# Altium project EFI_Main_Board-V1.11.PrjPcb (part 1 of 4)
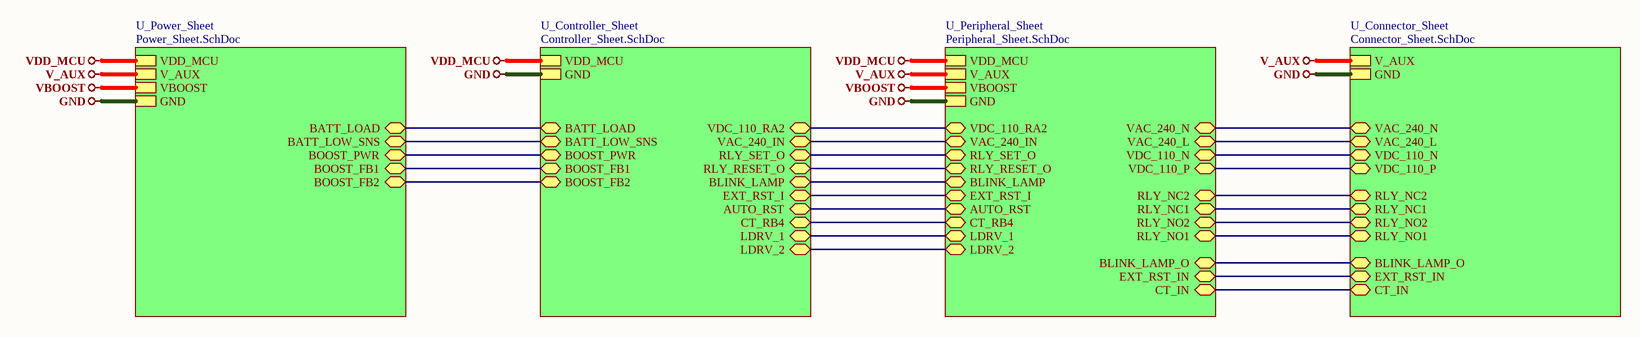
[diagram p0: Top-Sheet.SchDoc]
5 sheets, 101 parts. Net scope: hierarchical (ports join the sheet entries above them; power ports are global).
Board file: EFI.PcbDoc
Sheets:
  Top-Sheet.SchDoc
    U_Controller_Sheet = Controller_Sheet.SchDoc
    U_Power_Sheet = Power_Sheet.SchDoc
    U_Connector_Sheet = Connector_Sheet.SchDoc
    U_Peripheral_Sheet = Peripheral_Sheet.SchDoc

## Sheet Top-Sheet.SchDoc
size 420 x 297 mm; SheetNumber: 1; SheetTotal: 5

### Sub-sheets
U_Connector_Sheet = Connector_Sheet.SchDoc: VAC_240_N (bidir), VAC_240_L (bidir), V_AUX, GND, VDC_110_N (bidir), VDC_110_P (bidir), RLY_NC2 (bidir), RLY_NC1 (bidir), RLY_NO2 (bidir), RLY_NO1 (bidir), BLINK_LAMP_O (bidir), EXT_RST_IN (bidir), CT_IN (bidir)
U_Controller_Sheet = Controller_Sheet.SchDoc: VDC_110_RA2 (bidir), VAC_240_IN (bidir), RLY_SET_O (bidir), RLY_RESET_O (bidir), VDD_MCU, GND, BLINK_LAMP (bidir), EXT_RST_I (bidir), AUTO_RST (bidir), CT_RB4 (bidir), LDRV_1 (bidir), LDRV_2 (bidir), BATT_LOAD (bidir), BATT_LOW_SNS (bidir), BOOST_PWR (bidir), BOOST_FB1 (bidir), BOOST_FB2 (bidir)
U_Peripheral_Sheet = Peripheral_Sheet.SchDoc: VDD_MCU, V_AUX, VBOOST, GND, VDC_110_RA2 (bidir), VAC_240_IN (bidir), RLY_SET_O (bidir), RLY_RESET_O (bidir), BLINK_LAMP (bidir), EXT_RST_I (bidir), AUTO_RST (bidir), CT_RB4 (bidir), LDRV_1 (bidir), LDRV_2 (bidir), VAC_240_N (bidir), VAC_240_L (bidir), VDC_110_N (bidir), VDC_110_P (bidir), RLY_NC2 (bidir), RLY_NC1 (bidir), RLY_NO2 (bidir), RLY_NO1 (bidir), BLINK_LAMP_O (bidir), EXT_RST_IN (bidir), CT_IN (bidir)
U_Power_Sheet = Power_Sheet.SchDoc: VDD_MCU, V_AUX, VBOOST, GND, BATT_LOAD (bidir), BATT_LOW_SNS (bidir), BOOST_PWR (bidir), BOOST_FB1 (bidir), BOOST_FB2 (bidir)

### Nets
GND: sheet U_Controller_Sheet/GND, sheet U_Power_Sheet/GND, sheet U_Connector_Sheet/GND, sheet U_Peripheral_Sheet/GND
V_AUX: sheet U_Power_Sheet/V_AUX, sheet U_Connector_Sheet/V_AUX, sheet U_Peripheral_Sheet/V_AUX
VBOOST: sheet U_Power_Sheet/VBOOST, sheet U_Peripheral_Sheet/VBOOST
VDD_MCU: sheet U_Controller_Sheet/VDD_MCU, sheet U_Power_Sheet/VDD_MCU, sheet U_Peripheral_Sheet/VDD_MCU
AUTO_RST: sheet U_Controller_Sheet/AUTO_RST, sheet U_Peripheral_Sheet/AUTO_RST
BATT_LOAD: sheet U_Controller_Sheet/BATT_LOAD, sheet U_Power_Sheet/BATT_LOAD
BATT_LOW_SNS: sheet U_Controller_Sheet/BATT_LOW_SNS, sheet U_Power_Sheet/BATT_LOW_SNS
BLINK_LAMP: sheet U_Controller_Sheet/BLINK_LAMP, sheet U_Peripheral_Sheet/BLINK_LAMP
BLINK_LAMP_O: sheet U_Connector_Sheet/BLINK_LAMP_O, sheet U_Peripheral_Sheet/BLINK_LAMP_O
BOOST_FB1: sheet U_Controller_Sheet/BOOST_FB1, sheet U_Power_Sheet/BOOST_FB1
BOOST_FB2: sheet U_Controller_Sheet/BOOST_FB2, sheet U_Power_Sheet/BOOST_FB2
BOOST_PWR: sheet U_Controller_Sheet/BOOST_PWR, sheet U_Power_Sheet/BOOST_PWR
CT_IN: sheet U_Connector_Sheet/CT_IN, sheet U_Peripheral_Sheet/CT_IN
CT_RB4: sheet U_Controller_Sheet/CT_RB4, sheet U_Peripheral_Sheet/CT_RB4
EXT_RST_I: sheet U_Controller_Sheet/EXT_RST_I, sheet U_Peripheral_Sheet/EXT_RST_I
EXT_RST_IN: sheet U_Connector_Sheet/EXT_RST_IN, sheet U_Peripheral_Sheet/EXT_RST_IN
LDRV_1: sheet U_Controller_Sheet/LDRV_1, sheet U_Peripheral_Sheet/LDRV_1
LDRV_2: sheet U_Controller_Sheet/LDRV_2, sheet U_Peripheral_Sheet/LDRV_2
RLY_NC1: sheet U_Connector_Sheet/RLY_NC1, sheet U_Peripheral_Sheet/RLY_NC1
RLY_NC2: sheet U_Connector_Sheet/RLY_NC2, sheet U_Peripheral_Sheet/RLY_NC2
RLY_NO1: sheet U_Connector_Sheet/RLY_NO1, sheet U_Peripheral_Sheet/RLY_NO1
RLY_NO2: sheet U_Connector_Sheet/RLY_NO2, sheet U_Peripheral_Sheet/RLY_NO2
RLY_RESET_O: sheet U_Controller_Sheet/RLY_RESET_O, sheet U_Peripheral_Sheet/RLY_RESET_O
RLY_SET_O: sheet U_Controller_Sheet/RLY_SET_O, sheet U_Peripheral_Sheet/RLY_SET_O
VAC_240_IN: sheet U_Controller_Sheet/VAC_240_IN, sheet U_Peripheral_Sheet/VAC_240_IN
VAC_240_L: sheet U_Connector_Sheet/VAC_240_L, sheet U_Peripheral_Sheet/VAC_240_L
VAC_240_N: sheet U_Connector_Sheet/VAC_240_N, sheet U_Peripheral_Sheet/VAC_240_N
VDC_110_N: sheet U_Connector_Sheet/VDC_110_N, sheet U_Peripheral_Sheet/VDC_110_N
VDC_110_P: sheet U_Connector_Sheet/VDC_110_P, sheet U_Peripheral_Sheet/VDC_110_P
VDC_110_RA2: sheet U_Controller_Sheet/VDC_110_RA2, sheet U_Peripheral_Sheet/VDC_110_RA2

### Notes on the sheet
- Reflect Ein Technology Labs Sdn Bhd
- File:
- Title:
- Date:
- Page
- Num:
- Total:
- Drawn By: Nabil bin Feisal Bamadhaj

## Sheet Controller_Sheet.SchDoc
size 420 x 297 mm; SheetNumber: 3; SheetTotal: 5
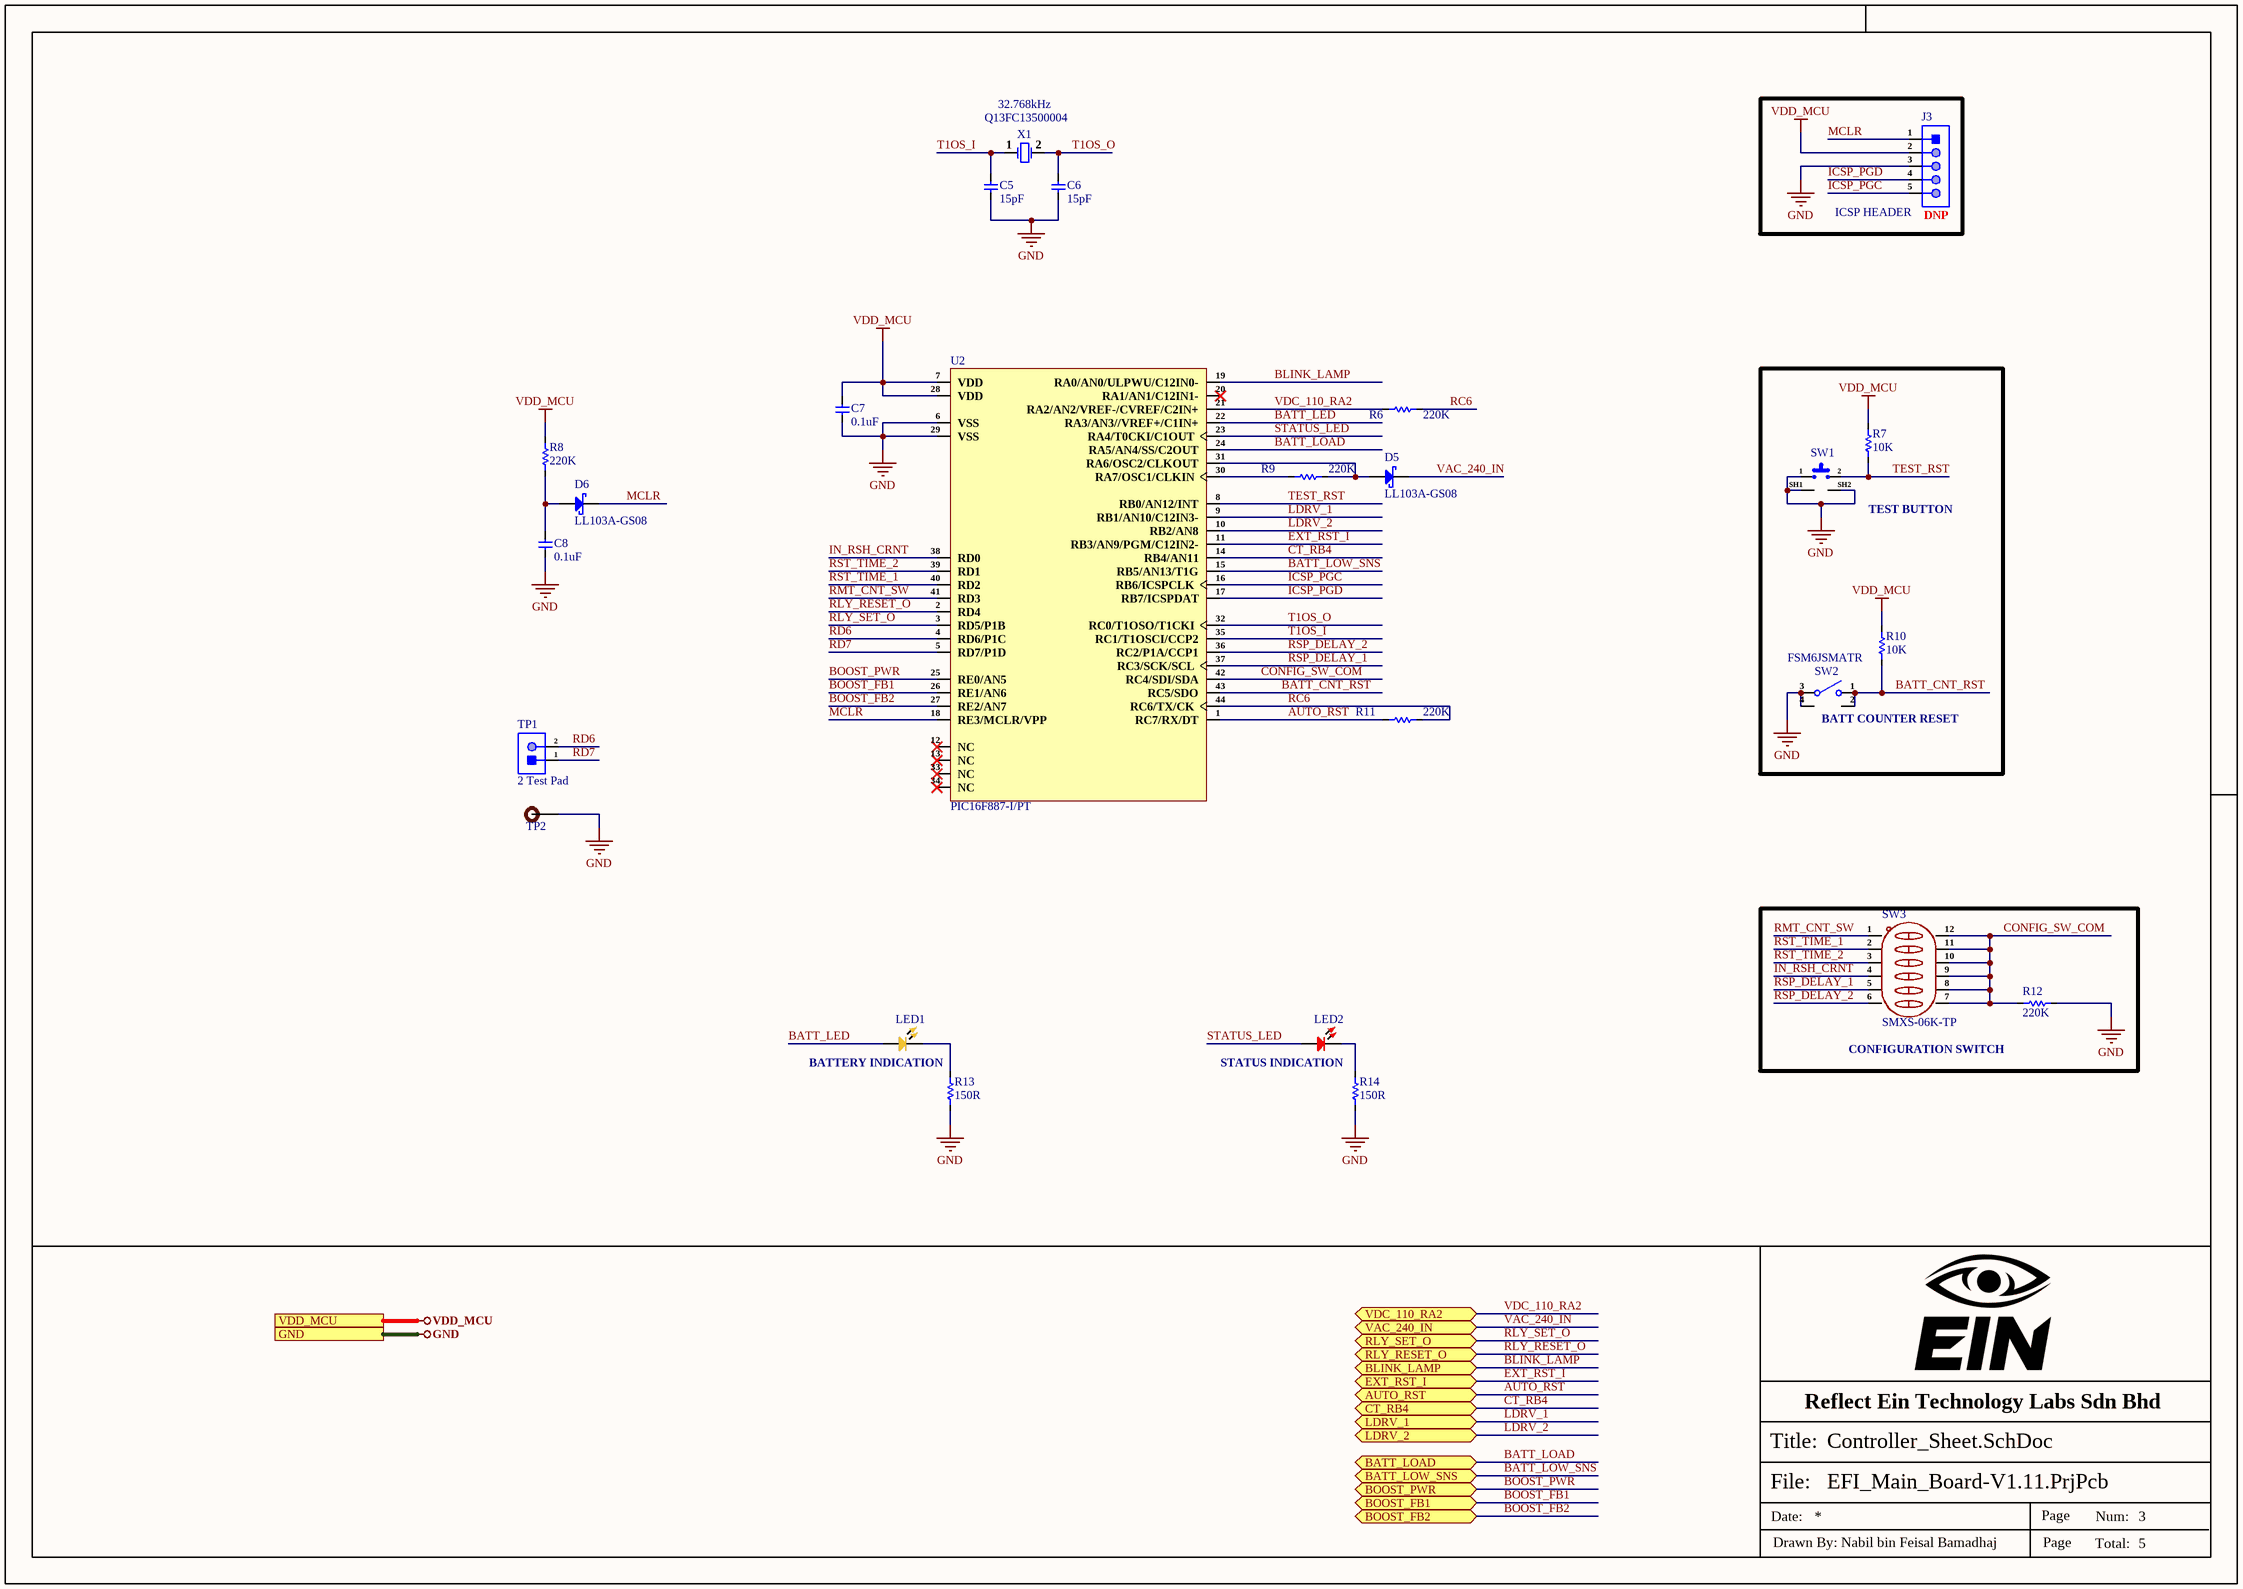
[diagram p1: Controller_Sheet.SchDoc]

### Parts
C5  15pF  [Cap-1206]
C6  15pF  [Cap-1206]
C7  0.1uF  [Cap-1206]
C8  0.1uF  [Cap-1206]
D5  LL103A-GS08  [LL-34]
D6  LL103A-GS08  [LL-34]
J3  X6511WV-05H-C60D30  [HDR1X5_]  (value not drawn)  (no BOM)
LED1  333-2UYD/S530-A3-L  [TH LED 5mm Yellow]  (value not drawn)
LED2  333-2SURC/S530-A3  [TH LED 5mm_]  (value not drawn)
R6  220K  [Res-1206]
R7  10K  [Res-1206]
R8  220K  [Res-1206]
R9  220K  [Res-1206]
R10  10K  [Res-1206]
R11  220K  [Res-1206]
R12  220K  [Res-1206]
R13  150R  [Res-1206]
R14  150R  [Res-1206]
SW1  1825027-8  [1825027-8]  (value not drawn)
SW2  FSM6JSMATR  [FSM6JSMATR]
SW3  SMXS-06K-TP  [SMXS-06K-TP]
TP1  2 Test Pad  [2 Test Pad]  (no BOM)
TP2  TEST POINT  [Test-point]  (value not drawn)  (no BOM)
U2  PIC16F887-I/PT  [44-TQFP (10x10)]
X1  Q13FC13500004  [SMD3215-2P]

### Blocks framed on the sheet
CONFIGURATION SWITCH: R12 SW3

### Ports
AUTO_RST (bidir, see Top-Sheet[3B], Peripheral_Sheet[3D]), BATT_LOAD (bidir, see Top-Sheet[3B], Power_Sheet[4D]), BATT_LOW_SNS (bidir, see Top-Sheet[3B], Power_Sheet[4D]), BLINK_LAMP (bidir, see Top-Sheet[3B], Peripheral_Sheet[3D]), BOOST_FB1 (bidir, see Top-Sheet[3B], Power_Sheet[4D]), BOOST_FB2 (bidir, see Top-Sheet[3B], Power_Sheet[4D]), BOOST_PWR (bidir, see Top-Sheet[3B], Power_Sheet[4D]), CT_RB4 (bidir, see Top-Sheet[3B], Peripheral_Sheet[3D]), EXT_RST_I (bidir, see Top-Sheet[3B], Peripheral_Sheet[3D]), GND (see Top-Sheet[3A], Connector_Sheet[1D], Peripheral_Sheet[1D], Power_Sheet[1D]), LDRV_1 (bidir, see Top-Sheet[3B], Peripheral_Sheet[3D]), LDRV_2 (bidir, see Top-Sheet[3B], Peripheral_Sheet[3D]), RLY_RESET_O (bidir, see Top-Sheet[3B], Peripheral_Sheet[3D]), RLY_SET_O (bidir, see Top-Sheet[3B], Peripheral_Sheet[3D]), VAC_240_IN (bidir, see Top-Sheet[3B], Peripheral_Sheet[3D]), VDC_110_RA2 (bidir, see Top-Sheet[3B], Peripheral_Sheet[3D]), VDD_MCU (see Top-Sheet[3A], Peripheral_Sheet[1D], Power_Sheet[1D])

### Nets
GND: C5.1 C6.1 C7.1 C8.1 J3.3 R12.1 R13.1 R14.1 SW1.1 SW1.SH1(GND) SW1.SH2(GND) SW2.3 SW2.4 TP2.1 U2.6(VSS) U2.29(VSS) ; port GND
VDD_MCU: C7.2 J3.2 R7.2 R8.2 R10.2 U2.7(VDD) U2.28(VDD) ; port VDD_MCU
AUTO_RST: R11.2 U2.1(RC7/RX/DT) ; port AUTO_RST
BATT_CNT_RST: R10.1 SW2.1 SW2.2 U2.43(RC5/SDO)
BATT_LED: LED1.2 U2.22(RA3/AN3//VREF+/C1IN+)
BATT_LOAD: U2.24(RA5/AN4/SS/C2OUT) ; port BATT_LOAD
BATT_LOW_SNS: U2.15(RB5/AN13/T1G) ; port BATT_LOW_SNS
BLINK_LAMP: U2.19(RA0/AN0/ULPWU/C12IN0-) ; port BLINK_LAMP
BOOST_FB1: U2.26(RE1/AN6) ; port BOOST_FB1
BOOST_FB2: U2.27(RE2/AN7) ; port BOOST_FB2
BOOST_PWR: U2.25(RE0/AN5) ; port BOOST_PWR
CONFIG_SW_COM: R12.2 SW3.7 SW3.8 SW3.9 SW3.10 SW3.11 SW3.12 U2.42(RC4/SDI/SDA)
CT_RB4: U2.14(RB4/AN11) ; port CT_RB4
EXT_RST_I: U2.11(RB3/AN9/PGM/C12IN2-) ; port EXT_RST_I
ICSP_PGC: J3.5 U2.16(RB6/ICSPCLK)
ICSP_PGD: J3.4 U2.17(RB7/ICSPDAT)
IN_RSH_CRNT: SW3.4 U2.38(RD0)
LDRV_1: U2.9(RB1/AN10/C12IN3-) ; port LDRV_1
LDRV_2: U2.10(RB2/AN8) ; port LDRV_2
MCLR: D6.1(K) J3.1 U2.18(RE3/MCLR/VPP)
RC6: R6.1 R11.1 U2.44(RC6/TX/CK)
RD6: TP1.2 U2.4(RD6/P1C)
RD7: TP1.1 U2.5(RD7/P1D)
RLY_RESET_O: U2.2(RD4) ; port RLY_RESET_O
RLY_SET_O: U2.3(RD5/P1B) ; port RLY_SET_O
RMT_CNT_SW: SW3.1 U2.41(RD3)
RSP_DELAY_1: SW3.5 U2.37(RC3/SCK/SCL)
RSP_DELAY_2: SW3.6 U2.36(RC2/P1A/CCP1)
RST_TIME_1: SW3.2 U2.40(RD2)
RST_TIME_2: SW3.3 U2.39(RD1)
STATUS_LED: LED2.2 U2.23(RA4/T0CKI/C1OUT)
T1OS_I: C5.2 U2.35(RC1/T1OSCI/CCP2) X1.1(OSC1)
T1OS_O: C6.2 U2.32(RC0/T1OSO/T1CKI) X1.2(OSC2)
TEST_RST: R7.1 SW1.2 U2.8(RB0/AN12/INT)
VAC_240_IN: D5.1(K) ; port VAC_240_IN
VDC_110_RA2: R6.2 U2.21(RA2/AN2/VREF-/CVREF/C2IN+) ; port VDC_110_RA2
NetC8_2: C8.2 D6.2(A) R8.1
NetD5_2: D5.2(A) R9.1 U2.31(RA6/OSC2/CLKOUT)
NetLED1_1: LED1.1 R13.2
NetLED2_1: LED2.1 R14.2
NetR9_2: R9.2 U2.30(RA7/OSC1/CLKIN)

Not connected (* = marked no-connect by the designer): U2 12(NC)* 13(NC)* 20(RA1/AN1/C12IN1-)* 33(NC)* 34(NC)*

### Notes on the sheet
- (near X1) 32.768kHz
- (near J3) ICSP HEADER
- (near J3) DNP
- TEST BUTTON
- (near SW2) BATT COUNTER RESET
- (near LED1) BATTERY INDICATION
- (near LED2) STATUS INDICATION
- Reflect Ein Technology Labs Sdn Bhd
- File:
- Title:
- Date:
- Page
- Num:
- Total:
- Drawn By: Nabil bin Feisal Bamadhaj

### Library data of the parts
C5 C6 = CC1206JRNPO9BN150: CAP CER 15PF 50V C0G/NPO 1206; Manufacturer: Yageo; Item Type: Capacitors; Supplier: Future Electronics; LCSC Part Number: C541476; Manufacturer Part Number: CC1206JRNPO9BN150; RoHS: Yes; Stock: 4000; Pricing: 4000=0.0232, 12000=0.0227, 16000=0.0225, 40000=0.022, 60000=0.0216 (USD); Lead Free: 5697LeadFree; Halogen Free: 5694HalogenFree; ComponentLink1URL: https://datasheet.ciiva.com/156/mlccorderingcode-156381.pdf?src-supplier=Digikey; ComponentLink1Description: https://datasheet.ciiva.com/156/mlccorderingcode-156381.pdf?src-supplier=Digikey; ComponentLink2URL: https://datasheet.ciiva.com/156/mlccorderingcode-156382.pdf?src-supplier=Digikey; ComponentLink2Description: https://datasheet.ciiva.com/156/mlccorderingcode-156382.pdf?src-supplier=Digikey; ComponentLink3URL: https://datasheet.ciiva.com/156/mlccorderingcode-156383.pdf?src-supplier=Digikey; ComponentLink3Description: https://datasheet.ciiva.com/156/mlccorderingcode-156383.pdf?src-supplier=Digikey; ComponentLink4URL: https://datasheet.ciiva.com/26863/getdatasheetpartid-94181-26863045.pdf?src-supplier=Verical; ComponentLink4Description: https://datasheet.ciiva.com/26863/getdatasheetpartid-94181-26863045.pdf?src-supplier=Verical; ComponentLink5URL: https://datasheet.ciiva.com/29242/445461-da-01-en-kerko-chip-1206-np0-15pf-5proz-50vg-29242151.pdf?src-supplier=Conrad; ComponentLink5Description: https://datasheet.ciiva.com/29242/445461-da-01-en-kerko-chip-1206-np0-15pf-5proz-50vg-29242151.pdf?src-supplier=Conrad
C7 C8 = CC1206KRX7R9BB104: CAP CER 0.1UF 50V X7R 1206; Manufacturer: Yageo; Item Type: Capacitor; Material: Ceramic; Value: 100nF; Tolerance: 10%; Insulation Resistance: 100GR; Supplier: Digikey; LCSC Part Number: 311-1179-1-ND; Manufacturer Part Number: CC1206KRX7R9BB104; RoHS: Yes; Stock: 520624; Pricing: 1=0.19, 10=0.128, 50=0.0764, 100=0.0601, 500=0.04436, 1000=0.03672 (USD); Mounting Technology: Surface Mount; Case/Package: 1206; Pins: 2; Case Code (Metric): 3216; Case Code (Imperial): 1206; Min Operating Temperature: -55°C; Max Operating Temperature: 125°C; Dielectric: X7R; Packaging: Tape and Reel; Voltage Rating: 50V; Termination: SMD/SMT; Voltage: 50V; Voltage Rating (DC): 50V; Series: CC; Length: 3.2mm; Height: 0.85mm; Depth: 1.6mm; Radiation Hardening: No; RoHS Compliant: Yes; Reach SVHC Compliant: Unknown; Lead Free: 5697LeadFree; Halogen Free: 5694HalogenFree; ComponentLink1URL: https://datasheet.ciiva.com/11786/0900766b80d84f1d-11786968.pdf?src-supplier=Rs; ComponentLink1Description: https://datasheet.ciiva.com/11786/0900766b80d84f1d-11786968.pdf?src-supplier=Rs; ComponentLink2URL: https://datasheet.ciiva.com/7978/1489800-7978230.pdf?src-supplier=Element14; ComponentLink2Description: https://datasheet.ciiva.com/7978/1489800-7978230.pdf?src-supplier=Element14; ComponentLink3URL: https://datasheet.ciiva.com/28450/1489800-28450892.pdf?src-supplier=Element14; ComponentLink3Description: https://datasheet.ciiva.com/28450/1489800-28450892.pdf?src-supplier=Element14; ComponentLink4URL: https://datasheet.ciiva.com/144/mlccorderingcode-144906.pdf?src-supplier=Digikey; ComponentLink4Description: https://datasheet.ciiva.com/144/mlccorderingcode-144906.pdf?src-supplier=Digikey; ComponentLink5URL: https://datasheet.ciiva.com/144/mlccorderingcode-144905.pdf?src-supplier=Digikey; ComponentLink5Description: https://datasheet.ciiva.com/144/mlccorderingcode-144905.pdf?src-supplier=Digikey; ComponentLink6URL: https://datasheet.ciiva.com/144/mlccorderingcode-144907.pdf?src-supplier=Digikey; ComponentLink6Description: https://datasheet.ciiva.com/144/mlccorderingcode-144907.pdf?src-supplier=Digikey; ComponentLink7URL: https://datasheet.ciiva.com/5425/upy-gp-np0-16v-to-50v-8-3714-5425561.pdf?src-supplier=Mouser; ComponentLink7Description: https://datasheet.ciiva.com/5425/upy-gp-np0-16v-to-50v-8-3714-5425561.pdf?src-supplier=Mouser; ComponentLink8URL: https://datasheet.ciiva.com/28363/1734573-28363672.pdf?src-supplier=Element14; ComponentLink8Description: https://datasheet.ciiva.com/28363/1734573-28363672.pdf?src-supplier=Element14; ComponentLink9URL: https://datasheet.ciiva.com/46385/1734573-46385063.pdf?src-supplier=Element14; ComponentLink9Description: https://datasheet.ciiva.com/46385/1734573-46385063.pdf?src-supplier=Element14; ComponentLink10URL: https://datasheet.ciiva.com/15189/getdatasheetpartid-251811-15189275.pdf?src-supplier=Verical; ComponentLink10Description: https://datasheet.ciiva.com/15189/getdatasheetpartid-251811-15189275.pdf?src-supplier=Verical
D5 D6 = LL103A-GS08: DIODE SCHOTTKY 40V 200MA SOD80; Manufacturer: Vishay; Item Type: Schottky Diodes; Body Material: Glass; Value: 50pF; Current Rating: 400A; Element Configuration: Single; Forward Voltage: 370mV; Max Forward Surge Current (Ifsm): 15A; Max Junction Temperature (Tj): 125°C; Max Power Dissipation: 400mW; Max Reverse Leakage Current: 5µA; Number of Elements: 1; Recovery Time: 10ns; Supplier: Avnet; LCSC Part Number: C2979792; Manufacturer Part Number: LL103A-GS08; RoHS: Compliant; Stock: 37500; Pricing: 12500=0.05045 (USD); Average Rectified Current: 200mA; China RoHS: Non-Compliant; Contact Plating: Silver, Tin; Diameter: 1.6mm; Forward Current: 200mA; Height: 1.6mm; Lead Free: Lead Free; Length: 3.7mm; Lifecycle Status: Production; Max Operating Temperature: 125°C; Max Output current: 200mA; Max Repetitive Reverse Voltage (Vrrm): 40V; Max Reverse Voltage (DC): 40V; Max Surge Current: 15A; Min Operating Temperature: -65°C; Mounting Technology: Surface Mount; Pins: 2; Number of Terminals: 2; Packaging: Cut Tape; Peak Non-Repetitive Surge Current: 15A; Peak Reverse Current: 5µA; Power Dissipation: 400mW; Radiation Hardening: No; REACH SVHC: Yes; Reverse Recovery Time: 10ns; Reverse Standoff Voltage: 40V; Reverse Voltage: 40V; Schedule B: 8541100070, 8541100070|8541100070|8541100070|8541100070|8541100070; Width: 1.6mm; ComponentLink1URL: https://datasheet.octopart.com:443/LL103A-GS08-Vishay-datasheet-181469840.pdf?src-supplier=Farnell; ComponentLink1Description: https://datasheet.octopart.com:443/LL103A-GS08-Vishay-datasheet-181469840.pdf?src-supplier=Farnell; ComponentLink2URL: https://datasheet.octopart.com:443/LL103A-GS08-Vishay-datasheet-10540872.pdf?src-supplier=Farnell; ComponentLink2Description: https://datasheet.octopart.com:443/LL103A-GS08-Vishay-datasheet-10540872.pdf?src-supplier=Farnell; ComponentLink3URL: https://datasheet.octopart.com:443/LL103A-GS08-Vishay-datasheet-8365623.pdf?src-supplier=Farnell; ComponentLink3Description: https://datasheet.octopart.com:443/LL103A-GS08-Vishay-datasheet-8365623.pdf?src-supplier=Farnell; ComponentLink4URL: https://datasheet.octopart.com:443/LL103A-GS08-Vishay-datasheet-11751478.pdf?src-supplier=_legacy+Avnet; ComponentLink4Description: https://datasheet.octopart.com:443/LL103A-GS08-Vishay-datasheet-11751478.pdf?src-supplier=_legacy+Avnet; ComponentLink5URL: https://datasheet.octopart.com:443/LL103A-GS08-Vishay-datasheet-181483661.pdf?src-supplier=IHS; ComponentLink5Description: https://datasheet.octopart.com:443/LL103A-GS08-Vishay-datasheet-181483661.pdf?src-supplier=IHS; ComponentLink6URL: https://datasheet.octopart.com:443/LL103A-GS08-Vishay-datasheet-62318247.pdf?src-supplier=Newark; ComponentLink6Description: https://datasheet.octopart.com:443/LL103A-GS08-Vishay-datasheet-62318247.pdf?src-supplier=Newark; ComponentLink7URL: https://datasheet.octopart.com:443/LL103A-GS08.-Vishay-datasheet-184398164.pdf?src-supplier=Newark; ComponentLink7Description: https://datasheet.octopart.com:443/LL103A-GS08.-Vishay-datasheet-184398164.pdf?src-supplier=Newark; ComponentLink8URL: https://datasheet.octopart.com:443/LL103A-GS08-Vishay-datasheet-21268782.pdf?src-supplier=Newark; ComponentLink8Description: https://datasheet.octopart.com:443/LL103A-GS08-Vishay-datasheet-21268782.pdf?src-supplier=Newark; ComponentLink9URL: https://datasheet.octopart.com:443/LL103A-GS08-Vishay-datasheet-7183.pdf?src-supplier=Newark; ComponentLink9Description: https://datasheet.octopart.com:443/LL103A-GS08-Vishay-datasheet-7183.pdf?src-supplier=Newark; ComponentLink10URL: https://datasheet.octopart.com:443/LL103A-GS08-Vishay-datasheet-5392692.pdf?src-supplier=element14; ComponentLink10Description: https://datasheet.octopart.com:443/LL103A-GS08-Vishay-datasheet-5392692.pdf?src-supplier=element14; ComponentLink11URL: https://datasheet.octopart.com:443/LL103A-GS08-Vishay-datasheet-159617103.pdf?src-supplier=element14+APAC; ComponentLink11Description: https://datasheet.octopart.com:443/LL103A-GS08-Vishay-datasheet-159617103.pdf?src-supplier=element14+APAC; ComponentLink12URL: https://datasheet.octopart.com:443/LL103A-GS08-Vishay-datasheet-42424840.pdf?src-supplier=TME; ComponentLink12Description: https://datasheet.octopart.com:443/LL103A-GS08-Vishay-datasheet-42424840.pdf?src-supplier=TME; ComponentLink13URL: https://datasheet.octopart.com:443/LL103A-GS08-Vishay-datasheet-14186831.pdf?src-supplier=iiiC; ComponentLink13Description: https://datasheet.octopart.com:443/LL103A-GS08-Vishay-datasheet-14186831.pdf?src-supplier=iiiC; ComponentLink14URL: https://datasheet.octopart.com:443/LL103A-GS08-Vishay-datasheet-10014030.pdf?src-supplier=RS+(Formerly+Allied+Electronics); ComponentLink14Description: https://datasheet.octopart.com:443/LL103A-GS08-Vishay-datasheet-10014030.pdf?src-supplier=RS+(Formerly+Allied+Electronics); ComponentLink15URL: https://datasheet.octopart.com:443/LL103A-GS08-Vishay-datasheet-72214.pdf?src-supplier=RS+(Formerly+Allied+Electronics); ComponentLink15Description: https://datasheet.octopart.com:443/LL103A-GS08-Vishay-datasheet-72214.pdf?src-supplier=RS+(Formerly+Allied+Electronics); ComponentLink16URL: http://sigma.octopart.com:80/rohs_statement/Vishay-company-15.pdf?src-supplier=Compliance+Statements; ComponentLink16Description: http://sigma.octopart.com:80/rohs_statement/Vishay-company-15.pdf?src-supplier=Compliance+Statements
J3 = X6511WV-05H-C60D30: Gold 250V 3A Straight Square Pins 2.5mm 5P 260℃ 6mm -40℃~+105℃ 3mm 2.54mm Plugin Black Brass 1x5P Plugin,P=2.54mm Pin Headers ROHS; Manufacturer: XKB; Item Type: Male Header; ComponentLink1Description: LCSC; ComponentLink1URL: https://www.lcsc.com/product-detail/Pin-Headers_XKB-Connectivity-X6511WV-05H-C60D30_C706877.html; Manufacturer Part Number: X6511WV-05H-C60D30; Package: Plugin,P=2.54mm; LCSC Part Number: C706877
LED1 = 333-2UYD/S530-A3-L: LED YELLOW DIFFUSED 5MM T/H; Manufacturer: Everlight; Supplier: Digikey; LCSC Part Number: C88602; Manufacturer Part Number: 333-2UYD/S530-A3-L; RoHS: No; Item Type: LED
LED2 = 333-2SURC/S530-A3: LED RED CLEAR 5MM ROUND T/H; Manufacturer: Everlight; Item Type: LEDs; Supplier: Mouser; LCSC Part Number: C125756; Manufacturer Part Number: 333-2SURC/S530-A3; RoHS: Yes; Stock: 2460; Pricing: 1=0.45, 10=0.259, 50=0.259, 100=0.127, 1000=0.11, 10000=0.089 (USD); ComponentLink1URL: https://datasheet.ciiva.com/14183/07501489-14183693.pdf?src-supplier=Distrelec; ComponentLink1Description: https://datasheet.ciiva.com/14183/07501489-14183693.pdf?src-supplier=Distrelec; ComponentLink2URL: https://datasheet.ciiva.com/2119/333-2surc-s530-a3-2119388.pdf?src-supplier=Digikey; ComponentLink2Description: https://datasheet.ciiva.com/2119/333-2surc-s530-a3-2119388.pdf?src-supplier=Digikey
R6 R8 R9 R11 R12 = RT1206BRD07220KL: RES SMD 220K OHM 0.1% 1/4W 1206; Manufacturer: Yageo; Item Type: Resistors; Voltage Rating (DC): 200V; Supplier: Digikey; LCSC Part Number: C309663; Manufacturer Part Number: RT1206BRD07220KL; RoHS: Yes; Stock: 10004; Pricing: 1=0.34, 10=0.225, 50=0.1816, 100=0.1663, 500=0.1326, 1000=0.11628 (USD); Lead Free: 5697LeadFree; ComponentLink1URL: https://datasheet.ciiva.com/2587/pyu-rt-1-to-0-05-rohs-l-5-2587527.pdf?src-supplier=Digikey; ComponentLink1Description: https://datasheet.ciiva.com/2587/pyu-rt-1-to-0-05-rohs-l-5-2587527.pdf?src-supplier=Digikey
R7 R10 = AC1206FR-7W10KL: RES 10K OHM 1% 1/2W 1206; Manufacturer: Yageo; Item Type: Resistors; Value: 10kR; Supplier: Mouser; LCSC Part Number: C326700; Manufacturer Part Number: AC1206FR-7W10KL; RoHS: No; Stock: 10222; Pricing: 1=0.14, 10=0.052, 50=0.052, 100=0.029, 1000=0.018, 10000=0.011 (USD); Case/Package: 340Case; Packaging: 10Packaging
R13 R14 = FRC1206F1500TS: 250mW Thick Film Resistors 200V ±100ppm/℃ ±1% 150Ω 1206 Chip Resistor - Surface Mount ROHS; Manufacturer: FOJAN; Manufacturer Part Number: FRC1206F1500TS; Package: 1206; LCSC Part Number: C2933598; Item Type: Resistor; ComponentLink1Description: LCSC; ComponentLink1URL: https://www.lcsc.com/product-detail/Chip-Resistor-Surface-Mount_FOJAN-FRC1206F1500TS_C2933598.html
SW1 = 1825027-8: 50mA Lying SPST 24V Plugin Tactile Switches ROHS; Manufacturer: TE Connectivity; Supplier 1: Arrow Electronics; Manufacturer Part Number: 1825027-8; RoHS: Yes; Category: Pushbutton Switches; Stock 1: 178529; Pricing 1: 1=0.13800, 10=0.13370, 25=0.12590, 100=0.10940, 250=0.10570, 500=0.09520, 1000=0.07320, 2500=0.07250, 5000=0.06250 (USD); ComponentLink1URL: https://datasheet.ciiva.com/30072/eng-cd-1825027-f-30072833.pdf?src-supplier=Onlinecomponents.com; ComponentLink1Description: https://datasheet.ciiva.com/30072/eng-cd-1825027-f-30072833.pdf?src-supplier=Onlinecomponents.com; ComponentLink2URL: https://datasheet.ciiva.com/16393/1825027-8-16393346.pdf?src-supplier=Future+Electronics; ComponentLink2Description: https://datasheet.ciiva.com/16393/1825027-8-16393346.pdf?src-supplier=Future+Electronics; ComponentLink3URL: https://datasheet.ciiva.com/8164/eng-cd-1825027-g4-8164921.pdf?src-supplier=Avnet; ComponentLink3Description: https://datasheet.ciiva.com/8164/eng-cd-1825027-g4-8164921.pdf?src-supplier=Avnet; Supplier Part Number 1: 1825027-8; Item Type: Tactile Switch
SW2 = FSM6JSMATR: SWITCH TACTILE SPST-NO 0.05A 24V; Manufacturer: TE Connectivity Alcoswitch; Item Type: Switches; Number of Positions: 2NUMBER; Supplier: Rs; LCSC Part Number: C6558197; Manufacturer Part Number: FSM6JSMATR; RoHS: Yes; Stock: 735; RoHS Compliant: 5897YesNo; ComponentLink1URL: https://datasheet.ciiva.com/7097/1486952-7097325.pdf?src-supplier=Newark; ComponentLink1Description: https://datasheet.ciiva.com/7097/1486952-7097325.pdf?src-supplier=Newark; ComponentLink2URL: https://datasheet.ciiva.com/1530/1714712-1530976.pdf?src-supplier=Element14; ComponentLink2Description: https://datasheet.ciiva.com/1530/1714712-1530976.pdf?src-supplier=Element14; ComponentLink3URL: https://datasheet.ciiva.com/15184/getdatasheetpartid-167889-15184443.pdf?src-supplier=Verical; ComponentLink3Description: https://datasheet.ciiva.com/15184/getdatasheetpartid-167889-15184443.pdf?src-supplier=Verical; ComponentLink4URL: https://datasheet.ciiva.com/8082/eng-cs-1308111-1-switches-core-program-catalog-0308-8082682.pdf?src-supplier=Avnet; ComponentLink4Description: https://datasheet.ciiva.com/8082/eng-cs-1308111-1-switches-core-program-catalog-0308-8082682.pdf?src-supplier=Avnet
SW3 = SMXS-06K-TP: 6 digits 24V Black 25mA 3000 Times SMD DIP Switches ROHS; Manufacturer: SM Switch; Manufacturer Part Number: SMXS-06K-TP; Package: SMD; LCSC Part Number: C5439765; Item Type: DIP SWITCH; ComponentLink1Description: LCSC; ComponentLink1URL: https://www.lcsc.com/product-detail/DIP-Switches_SM-Switch-SMXS-06K-TP_C5439765.html
TP1 = 2 Test Pad: Wire Connecting Pad; Item Type: Test Point; Manufacturer Part Number: 2 Test Pad
TP2 = TEST POINT: Test Point ON; Item Type: TEST POINT
U2 = PIC16F887-I/PT: IC MCU 8BIT 14KB FLASH 44TQFP; Manufacturer: Microchip; Access Time: 20us; Supplier: Arrow Electronics; LCSC Part Number: C31511; Manufacturer Part Number: PIC16F887-I/PT; RoHS: Yes; Item Type: IC; Stock: 46; Pricing: 1=2.91 (USD); Lead Free: 5697LeadFree; ComponentLink1URL: https://datasheet.ciiva.com/6149/41291f-6149840.pdf?src-supplier=Farnell; ComponentLink1Description: https://datasheet.ciiva.com/6149/41291f-6149840.pdf?src-supplier=Farnell; ComponentLink2URL: https://datasheet.ciiva.com/29119/160450-da-01-en-pic-pic16f887-i-pt-29119396.pdf?src-supplier=Conrad; ComponentLink2Description: https://datasheet.ciiva.com/29119/160450-da-01-en-pic-pic16f887-i-pt-29119396.pdf?src-supplier=Conrad; ComponentLink3URL: https://datasheet.ciiva.com/1489/41291g-1489550.pdf?src-supplier=Digikey; ComponentLink3Description: https://datasheet.ciiva.com/1489/41291g-1489550.pdf?src-supplier=Digikey; ComponentLink4URL: https://datasheet.ciiva.com/3203/41291f-3203503.pdf?src-supplier=Avnet; ComponentLink4Description: https://datasheet.ciiva.com/3203/41291f-3203503.pdf?src-supplier=Avnet; ComponentLink5URL: https://datasheet.ciiva.com/16211/filehandler-aspxddocname-en027084-16211484.pdf?src-supplier=Future+Electronics; ComponentLink5Description: https://datasheet.ciiva.com/16211/filehandler-aspxddocname-en027084-16211484.pdf?src-supplier=Future+Electronics; ComponentLink6URL: https://datasheet.ciiva.com/7892/41291f-7892232.pdf?src-supplier=Element14; ComponentLink6Description: https://datasheet.ciiva.com/7892/41291f-7892232.pdf?src-supplier=Element14; ComponentLink7URL: https://datasheet.ciiva.com/7892/1681365-7892233.pdf?src-supplier=Element14; ComponentLink7Description: https://datasheet.ciiva.com/7892/1681365-7892233.pdf?src-supplier=Element14
X1 = Q13FC13500004: 32.768kHz Surface Mount Crystal 12.5pF ±20ppm SMD3215-2P Crystals ROHS; Manufacturer: Epson; Supplier: Farnell; LCSC Part Number: C32346; Manufacturer Part Number: Q13FC13500004; RoHS: Yes; Item Type: Crystals; Stock: 52665; Reach SVHC Compliant: 4187SVHC; ComponentLink1URL: https://datasheet.octopart.com/Q13FC13500004-Epson-datasheet-62043850.pdf?src-supplier=Farnell; ComponentLink1Description: https://datasheet.octopart.com/Q13FC13500004-Epson-datasheet-62043850.pdf?src-supplier=Farnell; ComponentLink2URL: https://datasheet.octopart.com/Q13FC13500004-Epson-datasheet-32025749.pdf?src-supplier=Newark; ComponentLink2Description: https://datasheet.octopart.com/Q13FC13500004-Epson-datasheet-32025749.pdf?src-supplier=Newark

## Sheet Power_Sheet.SchDoc
size 420 x 297 mm; SheetNumber: 2; SheetTotal: 5
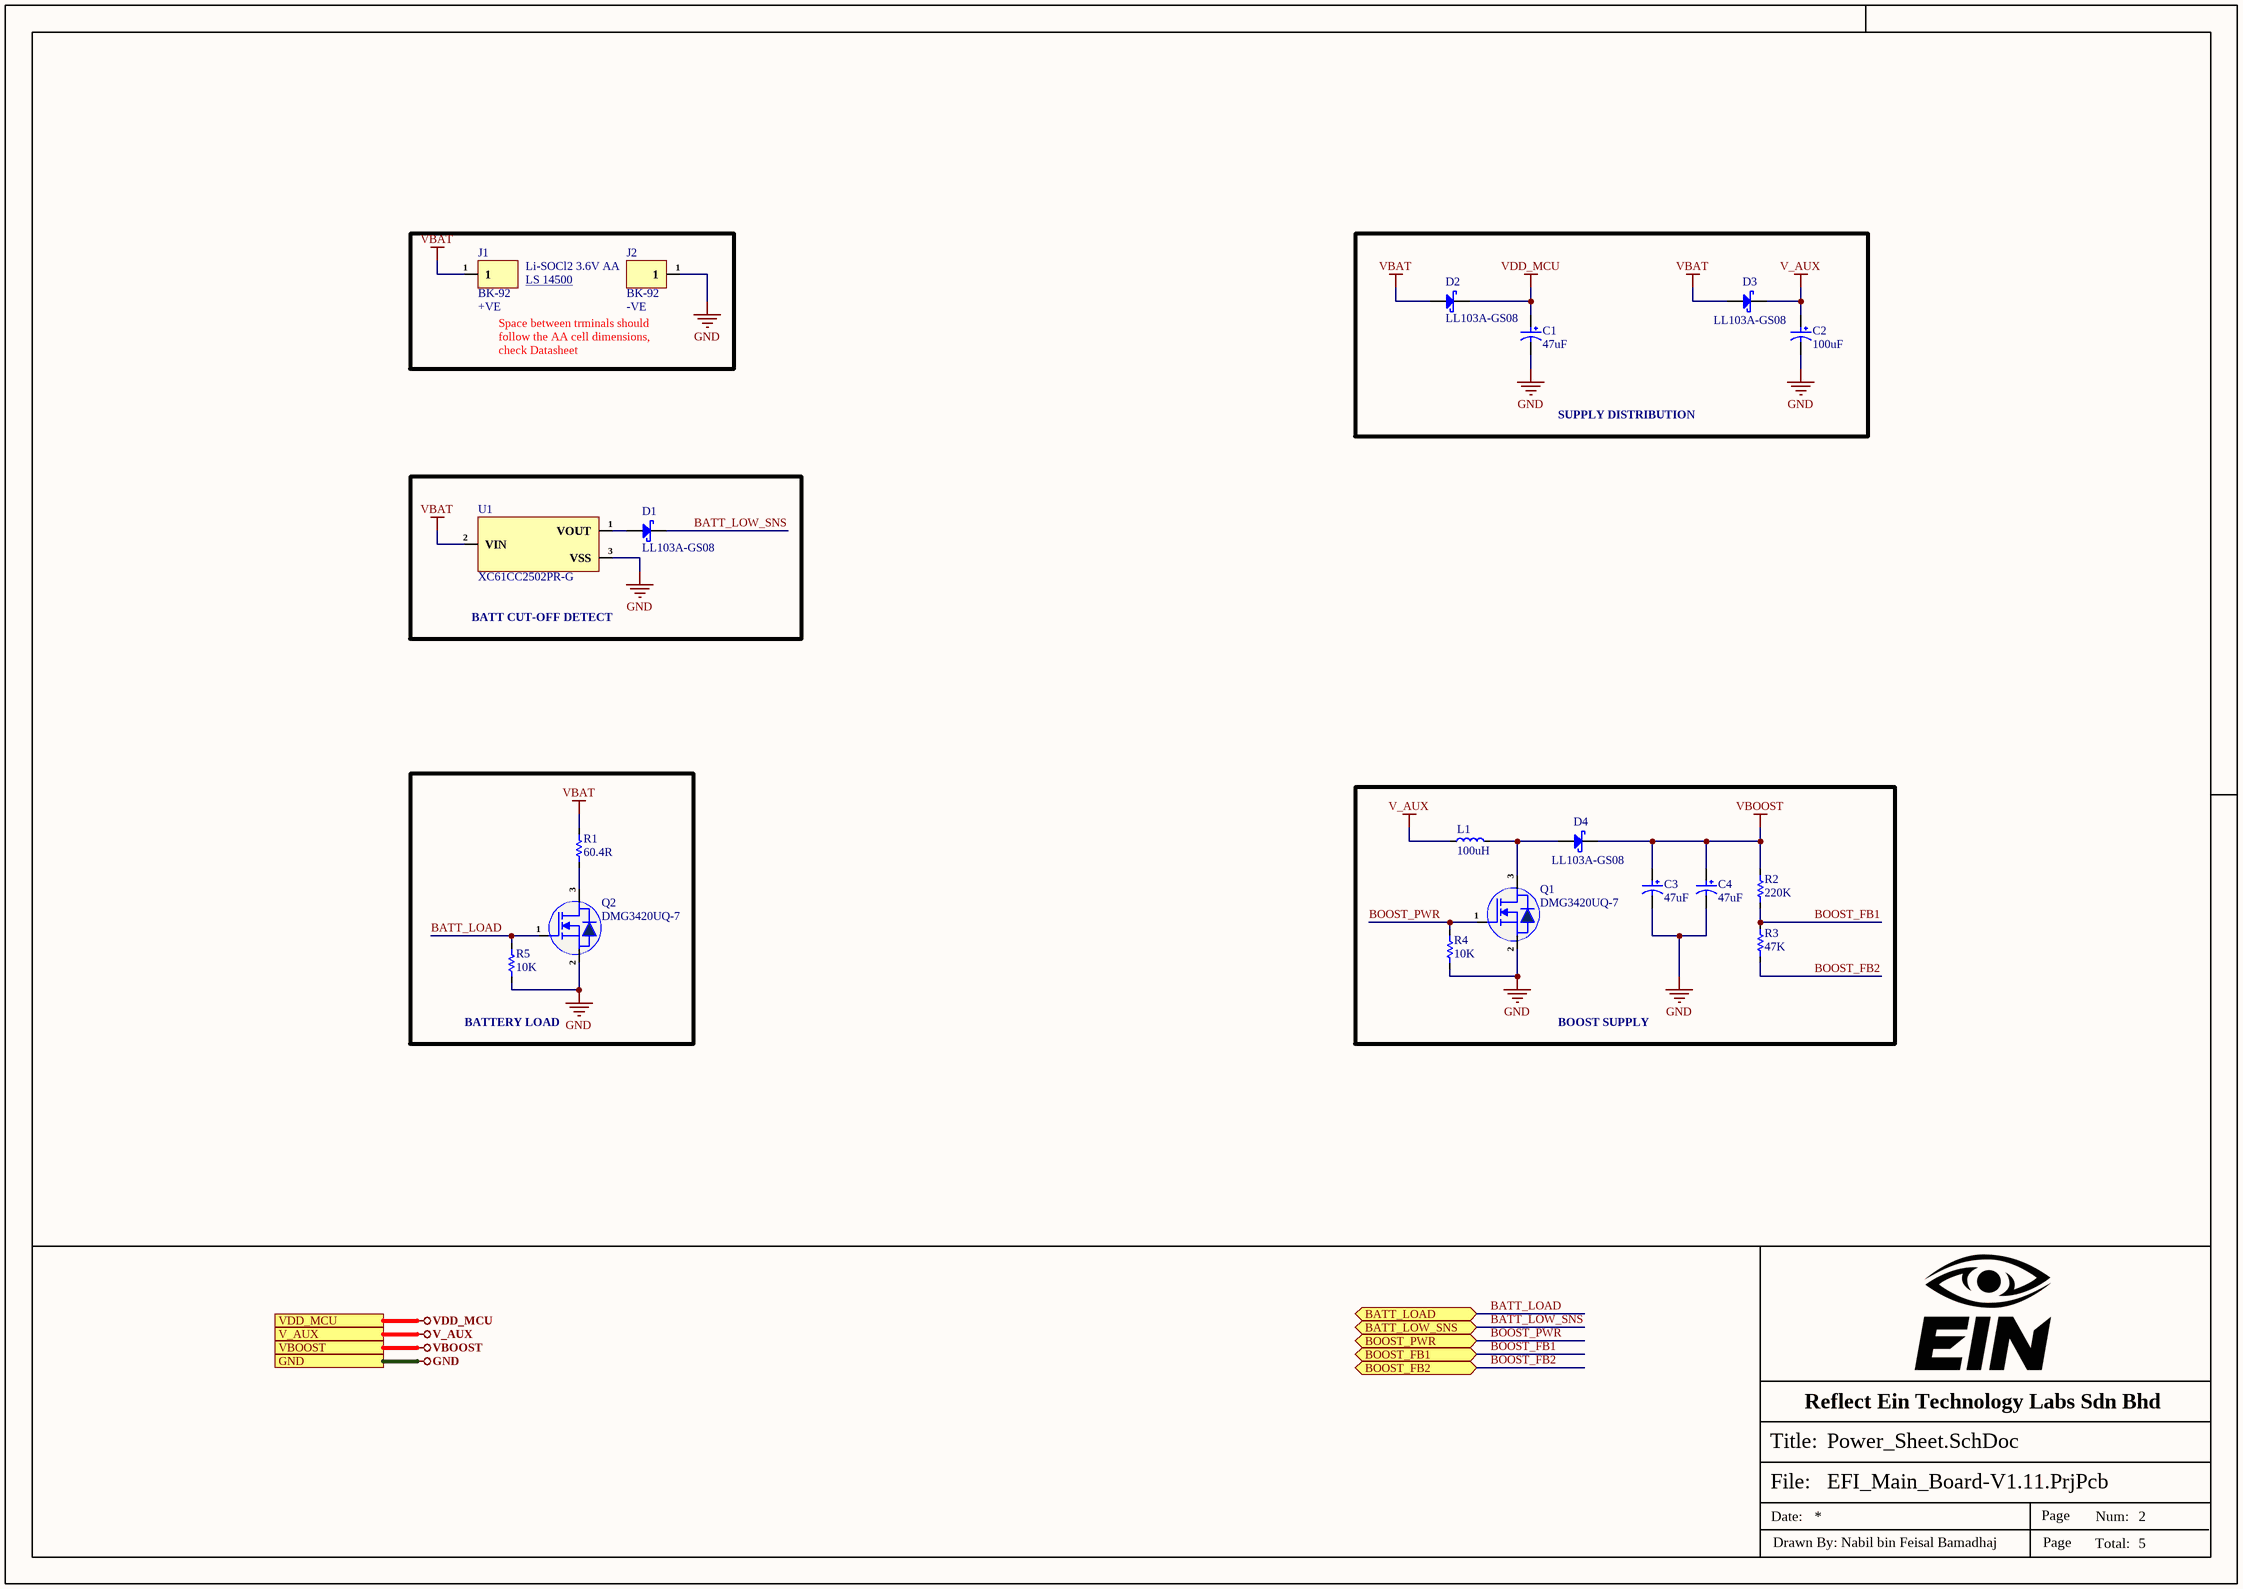
[diagram p2: Power_Sheet.SchDoc]

### Parts
C1  47uF  [Case-C]
C2  100uF  [Case-D]
C3  47uF  [Case-C]
C4  47uF  [Case-C]
D1  LL103A-GS08  [LL-34]
D2  LL103A-GS08  [LL-34]
D3  LL103A-GS08  [LL-34]
D4  LL103A-GS08  [LL-34]
J1  BK-92  [BK-92]
J2  BK-92  [BK-92]
L1  100uH  [NLV32T-101J-EF]
Q1  DMG3420UQ-7  [SOT-23]
Q2  DMG3420UQ-7  [SOT-23]
R1  60.4R  [Res-1206]
R2  220K  [Res-1206]
R3  47K  [Res-1206]
R4  10K  [Res-1206]
R5  10K  [Res-1206]
U1  XC61CC2502PR-G  [SOT-89-3]

### Blocks framed on the sheet
SUPPLY DISTRIBUTION: C1 C2 D2 D3
BATT CUT-OFF DETECT: D1 U1
BATTERY LOAD: Q2 R1 R5
BOOST SUPPLY: C3 C4 D4 L1 Q1 R2-R4

### Ports
BATT_LOAD (bidir, see Top-Sheet[2B], Controller_Sheet[4D]), BATT_LOW_SNS (bidir, see Top-Sheet[2B], Controller_Sheet[4D]), BOOST_FB1 (bidir, see Top-Sheet[2B], Controller_Sheet[4D]), BOOST_FB2 (bidir, see Top-Sheet[2B], Controller_Sheet[4D]), BOOST_PWR (bidir, see Top-Sheet[2B], Controller_Sheet[4D]), GND (see Top-Sheet[2B], Connector_Sheet[1D], Controller_Sheet[1D], Peripheral_Sheet[1D]), V_AUX (see Top-Sheet[2A], Connector_Sheet[1D], Peripheral_Sheet[1D]), VBOOST (see Top-Sheet[2B], Peripheral_Sheet[1D]), VDD_MCU (see Top-Sheet[2A], Controller_Sheet[1D], Peripheral_Sheet[1D])

### Nets
GND: C1.2 C2.2 C3.2 C4.2 J2.1 Q1.2(S) Q2.2(S) R4.1 R5.1 U1.3(VSS) ; port GND
V_AUX: C2.1 D3.1(K) L1.1 ; port V_AUX
VBAT: D2.2(A) D3.2(A) J1.1 R1.2 U1.2(VIN)
VBOOST: C3.1 C4.1 D4.1(K) R2.2 ; port VBOOST
VDD_MCU: C1.1 D2.1(K) ; port VDD_MCU
BATT_LOAD: Q2.1(G) R5.2 ; port BATT_LOAD
BATT_LOW_SNS: D1.1(K) ; port BATT_LOW_SNS
BOOST_FB1: R2.1 R3.2 ; port BOOST_FB1
BOOST_FB2: R3.1 ; port BOOST_FB2
BOOST_PWR: Q1.1(G) R4.2 ; port BOOST_PWR
NetD1_2: D1.2(A) U1.1(VOUT)
NetD4_2: D4.2(A) L1.2 Q1.3(D)
NetQ2_3: Q2.3(D) R1.1

### Notes on the sheet
- (near J1) +VE
- Li-SOCl2 3.6V AA
- (near J1) LS 14500 <https://uk.rs-online.com/web/p/aa-batteries/2019438>
- (near J2) -VE
- Space between trminals should follow the AA cell dimensions, check Datasheet
- Reflect Ein Technology Labs Sdn Bhd
- File:
- Title:
- Date:
- Page
- Num:
- Total:
- Drawn By: Nabil bin Feisal Bamadhaj

### Library data of the parts
C1 C3 C4 = 293D476X9016C2TE3: CAP TANT 47UF 10% 16V 2312; Manufacturer: Vishay Sprague; Item Type: Capacitors; Supplier: Mouser; LCSC Part Number: C129697; Manufacturer Part Number: 293D476X9016C2TE3; RoHS: Yes; Stock: 4282; Pricing: 1=0.47, 10=0.301, 50=0.301, 100=0.262, 1000=0.188, 10000=0.188 (USD); ComponentLink1URL: https://datasheet.ciiva.com/11793/0900766b80d97b37-11793330.pdf?src-supplier=Rs; ComponentLink1Description: https://datasheet.ciiva.com/11793/0900766b80d97b37-11793330.pdf?src-supplier=Rs; ComponentLink2URL: https://datasheet.ciiva.com/16305/293d-16305383.pdf?src-supplier=Future+Electronics; ComponentLink2Description: https://datasheet.ciiva.com/16305/293d-16305383.pdf?src-supplier=Future+Electronics; ComponentLink3URL: https://datasheet.ciiva.com/22695/438417-22695173.pdf?src-supplier=Element14; ComponentLink3Description: https://datasheet.ciiva.com/22695/438417-22695173.pdf?src-supplier=Element14; ComponentLink4URL: https://datasheet.ciiva.com/3004/293d-3004007.pdf?src-supplier=Avnet; ComponentLink4Description: https://datasheet.ciiva.com/3004/293d-3004007.pdf?src-supplier=Avnet; ComponentLink5URL: https://datasheet.ciiva.com/12910/293d-239871-12910805.pdf?src-supplier=Mouser; ComponentLink5Description: https://datasheet.ciiva.com/12910/293d-239871-12910805.pdf?src-supplier=Mouser; ComponentLink6URL: https://datasheet.ciiva.com/259/293d-259267.pdf?src-supplier=Digikey; ComponentLink6Description: https://datasheet.ciiva.com/259/293d-259267.pdf?src-supplier=Digikey; ComponentLink7URL: https://datasheet.ciiva.com/259/293d-259268.pdf?src-supplier=Digikey; ComponentLink7Description: https://datasheet.ciiva.com/259/293d-259268.pdf?src-supplier=Digikey; ComponentLink8URL: https://datasheet.ciiva.com/259/293d-259269.pdf?src-supplier=Digikey; ComponentLink8Description: https://datasheet.ciiva.com/259/293d-259269.pdf?src-supplier=Digikey; ComponentLink9URL: https://datasheet.ciiva.com/18710/293d-eng-18710842.pdf?src-supplier=Distrelec; ComponentLink9Description: https://datasheet.ciiva.com/18710/293d-eng-18710842.pdf?src-supplier=Distrelec; ComponentLink10URL: https://datasheet.ciiva.com/29244/455699-da-01-en-smd-kondensator-293d476x9016c2te3-500-st-29244151.pdf?src-supplier=Conrad; ComponentLink10Description: https://datasheet.ciiva.com/29244/455699-da-01-en-smd-kondensator-293d476x9016c2te3-500-st-29244151.pdf?src-supplier=Conrad
C2 = 293D107X9010D2TE3: CAP TANT 100UF 10% 10V 2917; Manufacturer: Vishay Sprague; Item Type: Capacitors; Dielectric Material: Tantalum; ESR (Equivalent Series Resistance): 600mR; Ripple Current: 350mA; Leakage Current: 10uA; Polarity: Polar; Dissipation Factor: 8%; Power Rating: 100mW; Q Factor: 8NUMBER; Supplier: Mouser; LCSC Part Number: C155463; Manufacturer Part Number: 293D107X9010D2TE3; RoHS: Yes; Stock: 119578; Pricing: 1=1.06, 10=0.468, 50=0.468, 100=0.38, 1000=0.265, 10000=0.258 (USD); Mounting Technology: Surface Mount,PCB; Case/Package: 2917; Case Code (Imperial): 2917; Case Code (Metric): 7343; Min Operating Temperature: -55°C; Max Operating Temperature: 125°C; Value: 100uF; Packaging: Tape and Reel; Tolerance: 10%; Voltage Rating: 10V; Voltage Rating (DC): 10V; Package Quantity: 500; Termination: SMD/SMT; Voltage: 10V; Features: General Purpose; Series: TANTAMOUNT®, 293D; Construction: Flat; Length: 7.3mm; Width: 2.8mm; Height: 2.8mm; Depth: 4.3mm; Radiation Hardening: No; Lead Free: Lead Free; RoHS Compliant: Yes; Reach SVHC Compliant: Unknown; ComponentLink1URL: https://datasheet.ciiva.com/1463/438417-1463240.pdf?src-supplier=Element14; ComponentLink1Description: https://datasheet.ciiva.com/1463/438417-1463240.pdf?src-supplier=Element14; ComponentLink2URL: https://datasheet.ciiva.com/22695/438417-22695119.pdf?src-supplier=Element14; ComponentLink2Description: https://datasheet.ciiva.com/22695/438417-22695119.pdf?src-supplier=Element14; ComponentLink3URL: https://datasheet.ciiva.com/3003/293d-3003852.pdf?src-supplier=Avnet; ComponentLink3Description: https://datasheet.ciiva.com/3003/293d-3003852.pdf?src-supplier=Avnet; ComponentLink4URL: https://datasheet.ciiva.com/16366/293d-16366280.pdf?src-supplier=Future+Electronics; ComponentLink4Description: https://datasheet.ciiva.com/16366/293d-16366280.pdf?src-supplier=Future+Electronics; ComponentLink5URL: https://datasheet.ciiva.com/15163/getdatasheetpartid-87118-15163221.pdf?src-supplier=Verical; ComponentLink5Description: https://datasheet.ciiva.com/15163/getdatasheetpartid-87118-15163221.pdf?src-supplier=Verical
D1-D4 = LL103A-GS08: as D5 on sheet Controller_Sheet; Supplier: Avnet; LCSC Part Number: C2979792; Manufacturer Part Number: LL103A-GS08; RoHS: Compliant; Stock: 37500; Pricing: 12500=0.05045 (USD); Average Rectified Current: 200mA; China RoHS: Non-Compliant; Contact Plating: Silver, Tin; Diameter: 1.6mm; Forward Current: 200mA; Height: 1.6mm; Lead Free: Lead Free; Length: 3.7mm; Lifecycle Status: Production; Max Operating Temperature: 125°C; Max Output current: 200mA; Max Repetitive Reverse Voltage (Vrrm): 40V; Max Reverse Voltage (DC): 40V; Max Surge Current: 15A; Min Operating Temperature: -65°C; Mounting Technology: Surface Mount; Pins: 2; Number of Terminals: 2; Packaging: Cut Tape; Peak Non-Repetitive Surge Current: 15A; Peak Reverse Current: 5µA; Power Dissipation: 400mW; Radiation Hardening: No; REACH SVHC: Yes; Reverse Recovery Time: 10ns; Reverse Standoff Voltage: 40V; Reverse Voltage: 40V; Schedule B: 8541100070, 8541100070|8541100070|8541100070|8541100070|8541100070; Width: 1.6mm; ComponentLink1URL: https://datasheet.octopart.com:443/LL103A-GS08-Vishay-datasheet-181469840.pdf?src-supplier=Farnell; ComponentLink1Description: https://datasheet.octopart.com:443/LL103A-GS08-Vishay-datasheet-181469840.pdf?src-supplier=Farnell; ComponentLink2URL: https://datasheet.octopart.com:443/LL103A-GS08-Vishay-datasheet-10540872.pdf?src-supplier=Farnell; ComponentLink2Description: https://datasheet.octopart.com:443/LL103A-GS08-Vishay-datasheet-10540872.pdf?src-supplier=Farnell; ComponentLink3URL: https://datasheet.octopart.com:443/LL103A-GS08-Vishay-datasheet-8365623.pdf?src-supplier=Farnell; ComponentLink3Description: https://datasheet.octopart.com:443/LL103A-GS08-Vishay-datasheet-8365623.pdf?src-supplier=Farnell; ComponentLink4URL: https://datasheet.octopart.com:443/LL103A-GS08-Vishay-datasheet-11751478.pdf?src-supplier=_legacy+Avnet; ComponentLink4Description: https://datasheet.octopart.com:443/LL103A-GS08-Vishay-datasheet-11751478.pdf?src-supplier=_legacy+Avnet; ComponentLink5URL: https://datasheet.octopart.com:443/LL103A-GS08-Vishay-datasheet-181483661.pdf?src-supplier=IHS; ComponentLink5Description: https://datasheet.octopart.com:443/LL103A-GS08-Vishay-datasheet-181483661.pdf?src-supplier=IHS; ComponentLink6URL: https://datasheet.octopart.com:443/LL103A-GS08-Vishay-datasheet-62318247.pdf?src-supplier=Newark; ComponentLink6Description: https://datasheet.octopart.com:443/LL103A-GS08-Vishay-datasheet-62318247.pdf?src-supplier=Newark; ComponentLink7URL: https://datasheet.octopart.com:443/LL103A-GS08.-Vishay-datasheet-184398164.pdf?src-supplier=Newark; ComponentLink7Description: https://datasheet.octopart.com:443/LL103A-GS08.-Vishay-datasheet-184398164.pdf?src-supplier=Newark; ComponentLink8URL: https://datasheet.octopart.com:443/LL103A-GS08-Vishay-datasheet-21268782.pdf?src-supplier=Newark; ComponentLink8Description: https://datasheet.octopart.com:443/LL103A-GS08-Vishay-datasheet-21268782.pdf?src-supplier=Newark; ComponentLink9URL: https://datasheet.octopart.com:443/LL103A-GS08-Vishay-datasheet-7183.pdf?src-supplier=Newark; ComponentLink9Description: https://datasheet.octopart.com:443/LL103A-GS08-Vishay-datasheet-7183.pdf?src-supplier=Newark; ComponentLink10URL: https://datasheet.octopart.com:443/LL103A-GS08-Vishay-datasheet-5392692.pdf?src-supplier=element14; ComponentLink10Description: https://datasheet.octopart.com:443/LL103A-GS08-Vishay-datasheet-5392692.pdf?src-supplier=element14; ComponentLink11URL: https://datasheet.octopart.com:443/LL103A-GS08-Vishay-datasheet-159617103.pdf?src-supplier=element14+APAC; ComponentLink11Description: https://datasheet.octopart.com:443/LL103A-GS08-Vishay-datasheet-159617103.pdf?src-supplier=element14+APAC; ComponentLink12URL: https://datasheet.octopart.com:443/LL103A-GS08-Vishay-datasheet-42424840.pdf?src-supplier=TME; ComponentLink12Description: https://datasheet.octopart.com:443/LL103A-GS08-Vishay-datasheet-42424840.pdf?src-supplier=TME; ComponentLink13URL: https://datasheet.octopart.com:443/LL103A-GS08-Vishay-datasheet-14186831.pdf?src-supplier=iiiC; ComponentLink13Description: https://datasheet.octopart.com:443/LL103A-GS08-Vishay-datasheet-14186831.pdf?src-supplier=iiiC; ComponentLink14URL: https://datasheet.octopart.com:443/LL103A-GS08-Vishay-datasheet-10014030.pdf?src-supplier=RS+(Formerly+Allied+Electronics); ComponentLink14Description: https://datasheet.octopart.com:443/LL103A-GS08-Vishay-datasheet-10014030.pdf?src-supplier=RS+(Formerly+Allied+Electronics); ComponentLink15URL: https://datasheet.octopart.com:443/LL103A-GS08-Vishay-datasheet-72214.pdf?src-supplier=RS+(Formerly+Allied+Electronics); ComponentLink15Description: https://datasheet.octopart.com:443/LL103A-GS08-Vishay-datasheet-72214.pdf?src-supplier=RS+(Formerly+Allied+Electronics); ComponentLink16URL: http://sigma.octopart.com:80/rohs_statement/Vishay-company-15.pdf?src-supplier=Compliance+Statements; ComponentLink16Description: http://sigma.octopart.com:80/rohs_statement/Vishay-company-15.pdf?src-supplier=Compliance+Statements
J1 J2 = BK-92: BATTERY CONTACT CLIP AA PC PIN; Manufacturer: Memory Protection Devices; Item Type: Battery Holder; Number of Cells: 1; Supplier: Digikey; Manufacturer Part Number: BK-92; RoHS: Yes; Stock: 124155; Pricing: 1=0.43, 10=0.353, 50=0.3104, 100=0.2934, 250=0.27248, 500=0.25762, 1000=0.24358, 2500=0.2262, 5000=0.21387 (USD); Mounting Technology: Through Hole,PCB; Series: -; Termination: PC Pin; ComponentLink1URL: https://datasheet.ciiva.com/4/bk-92-datasheet-4254.pdf?src-supplier=Digikey; ComponentLink1Description: https://datasheet.ciiva.com/4/bk-92-datasheet-4254.pdf?src-supplier=Digikey
L1 = NLV32T-101J-EF: FIXED IND 100UH 40MA 10 OHM SMD; Manufacturer: TDK; Item Type: Inductors; Core Material: Ferrite; Tolerance: 5%; Shielding: Unshielded; DC Resistance (DCR): 10R; Self Resonant Frequency: 10MHz; Test Frequency: 796kHz; Q Factor: 20; Supplier: Mouser; LCSC Part Number: C295124; Manufacturer Part Number: NLV32T-101J-EF; RoHS: Yes; Stock: 17406; Pricing: 1=0.22, 10=0.113, 50=0.113, 100=0.103, 1000=0.1, 10000=0.067 (USD); Mounting Technology: Surface Mount; Case/Package: 1210; Case Code (Metric): 3225; Case Code (Imperial): 1210; Weight: 0.001764oz; Min Operating Temperature: -40°C; Max Operating Temperature: 105°C; Package Quantity: 2000; Packaging: Tape and Reel; Current Rating: 40mA; Value: 100uH; Termination: SMD/SMT; Max DC Current: 40mA; Series: NLV-EF; Length: 0.126inch; Width: 0.098inch; Height: 2.2mm; Height - Seated (Max): 0.094inch; RoHS Compliant: Yes; Lead Free: Lead Free; ComponentLink1URL: http://www.mouser.com/ds/2/400/nductor_automotive_standard_nlv32-pfd_en-785075.pdf?src-supplier=Mouser; ComponentLink1Description: http://www.mouser.com/ds/2/400/nductor_automotive_standard_nlv32-pfd_en-785075.pdf?src-supplier=Mouser; ComponentLink2URL: https://product.tdk.com/info/en/catalog/datasheets/inductor_commercial_standard_nlv32-ef_en.pdf?src-supplier=Digikey; ComponentLink2Description: https://product.tdk.com/info/en/catalog/datasheets/inductor_commercial_standard_nlv32-ef_en.pdf?src-supplier=Digikey; ComponentLink3URL: https://product.tdk.com/info/en/catalog/datasheets/inductor_commercial_standard_nlv32-ef_en.pdf?ref_disty=digikey&src-supplier=Digikey; ComponentLink3Description: https://product.tdk.com/info/en/catalog/datasheets/inductor_commercial_standard_nlv32-ef_en.pdf?ref_disty=digikey&src-supplier=Digikey
Q1 Q2 = DMG3420UQ-7: MOSFET BVDSS: 8V~24V SOT23 T&R 3; Manufacturer: Diodes; Item Type: MOSFETs; Supplier: Digikey; LCSC Part Number: C5157847; Manufacturer Part Number: DMG3420UQ-7; RoHS: Yes; Stock: 5879; Pricing: 1=0.45, 10=0.276, 100=0.1748, 500=0.1308, 1000=0.11658 (USD); RoHS Compliant: Yes
R1 = AC1206FR-0760R4L: RES SMD 60.4 OHM 1% 1/4W 1206; Manufacturer: Yageo; Item Type: Resistors; Power Rating: 250mW; Voltage Rating: 200V; Temperature Coefficient: 100ppm/°C; Supplier: Future Electronics; LCSC Part Number: C144481; Manufacturer Part Number: AC1206FR-0760R4L; RoHS: Yes; Stock: 335000; Pricing: 5000=0.005, 20000=0.0048, 50000=0.0047, 125000=0.0045, 200000=0.0043 (USD); Case/Package: 1206; Case Code (Imperial): 1206; Case Code (Metric): 3216; Min Operating Temperature: -55°C; Max Operating Temperature: 155°C; Value: 60.4R; Tolerance: 1%; Packaging: Tape and Reel; Package Quantity: 1; Termination: SMD/SMT; Number of Terminations: 2; Max Power Dissipation: 250mW; Features: Moisture Resistant,Automotive AEC-Q200,Anti-Sulfur; Series: AC; Length: 0.122inch; Width: 0.063inch; Height: 0.026inch; Lead Free: Lead Free; RoHS Compliant: Yes; ComponentLink1URL: http://www.mouser.com/ds/2/447/yageodocoutput-1111992.pdf?src-supplier=Mouser; ComponentLink1Description: http://www.mouser.com/ds/2/447/yageodocoutput-1111992.pdf?src-supplier=Mouser; ComponentLink2URL: https://datasheet.octopart.com/AC1206FR-0760R4L-Yageo-datasheet-166720450.pdf?src-supplier=Future+Electronics; ComponentLink2Description: https://datasheet.octopart.com/AC1206FR-0760R4L-Yageo-datasheet-166720450.pdf?src-supplier=Future+Electronics; ComponentLink3URL: http://www.yageo.com/NewPortal/yageodocoutput?fileName=/pdf/R-Chip/PYu-AC_51_RoHS_L_6.pdf&src-supplier=Digikey; ComponentLink3Description: http://www.yageo.com/NewPortal/yageodocoutput?fileName=/pdf/R-Chip/PYu-AC_51_RoHS_L_6.pdf&src-supplier=Digikey; ComponentLink4URL: http://www.yageo.com/documents/recent/PYu-AC_51_RoHS_L_2_revised.pdf?src-supplier=Future+Electronics; ComponentLink4Description: http://www.yageo.com/documents/recent/PYu-AC_51_RoHS_L_2_revised.pdf?src-supplier=Future+Electronics
R2 = RT1206BRD07220KL: as R6 on sheet Controller_Sheet; Supplier: Digikey; LCSC Part Number: C309663; Manufacturer Part Number: RT1206BRD07220KL; RoHS: Yes; Stock: 10004; Pricing: 1=0.34, 10=0.225, 50=0.1816, 100=0.1663, 500=0.1326, 1000=0.11628 (USD); Lead Free: 5697LeadFree; ComponentLink1URL: https://datasheet.ciiva.com/2587/pyu-rt-1-to-0-05-rohs-l-5-2587527.pdf?src-supplier=Digikey; ComponentLink1Description: https://datasheet.ciiva.com/2587/pyu-rt-1-to-0-05-rohs-l-5-2587527.pdf?src-supplier=Digikey
R3 = ARG06BTC4702: 250mW Thin Film Resistor 200V ±25ppm/℃ ±0.1% 47kΩ 1206 Chip Resistor - Surface Mount ROHS; Manufacturer: Viking Tech; Manufacturer Part Number: ARG06BTC4702; Package: 1206; LCSC Part Number: C2828891; Item Type: Resistor; ComponentLink1Description: LCSC; ComponentLink1URL: https://www.lcsc.com/product-detail/Chip-Resistor-Surface-Mount_Viking-Tech-ARG06BTC4702_C2828891.html
R4 R5 = AC1206FR-7W10KL: as R7 on sheet Controller_Sheet; Supplier: Mouser; LCSC Part Number: C326700; Manufacturer Part Number: AC1206FR-7W10KL; RoHS: No; Stock: 10222; Pricing: 1=0.14, 10=0.052, 50=0.052, 100=0.029, 1000=0.018, 10000=0.011 (USD); Case/Package: 340Case; Packaging: 10Packaging
U1 = XC61CC2502PR-G: Supervisory Circuits; Manufacturer: Torex; Item Type: IC; Manufacturer Part Number: XC61CC2502PR-G; Package: SOT-89; LCSC Part Number: -; ComponentLink1Description: Torex; ComponentLink1URL: https://direct.torexsemi.com/en-us/product/xc61c/xc61cc2502pr-g

## Sheet Connector_Sheet.SchDoc
size 420 x 297 mm; SheetNumber: 5; SheetTotal: 5
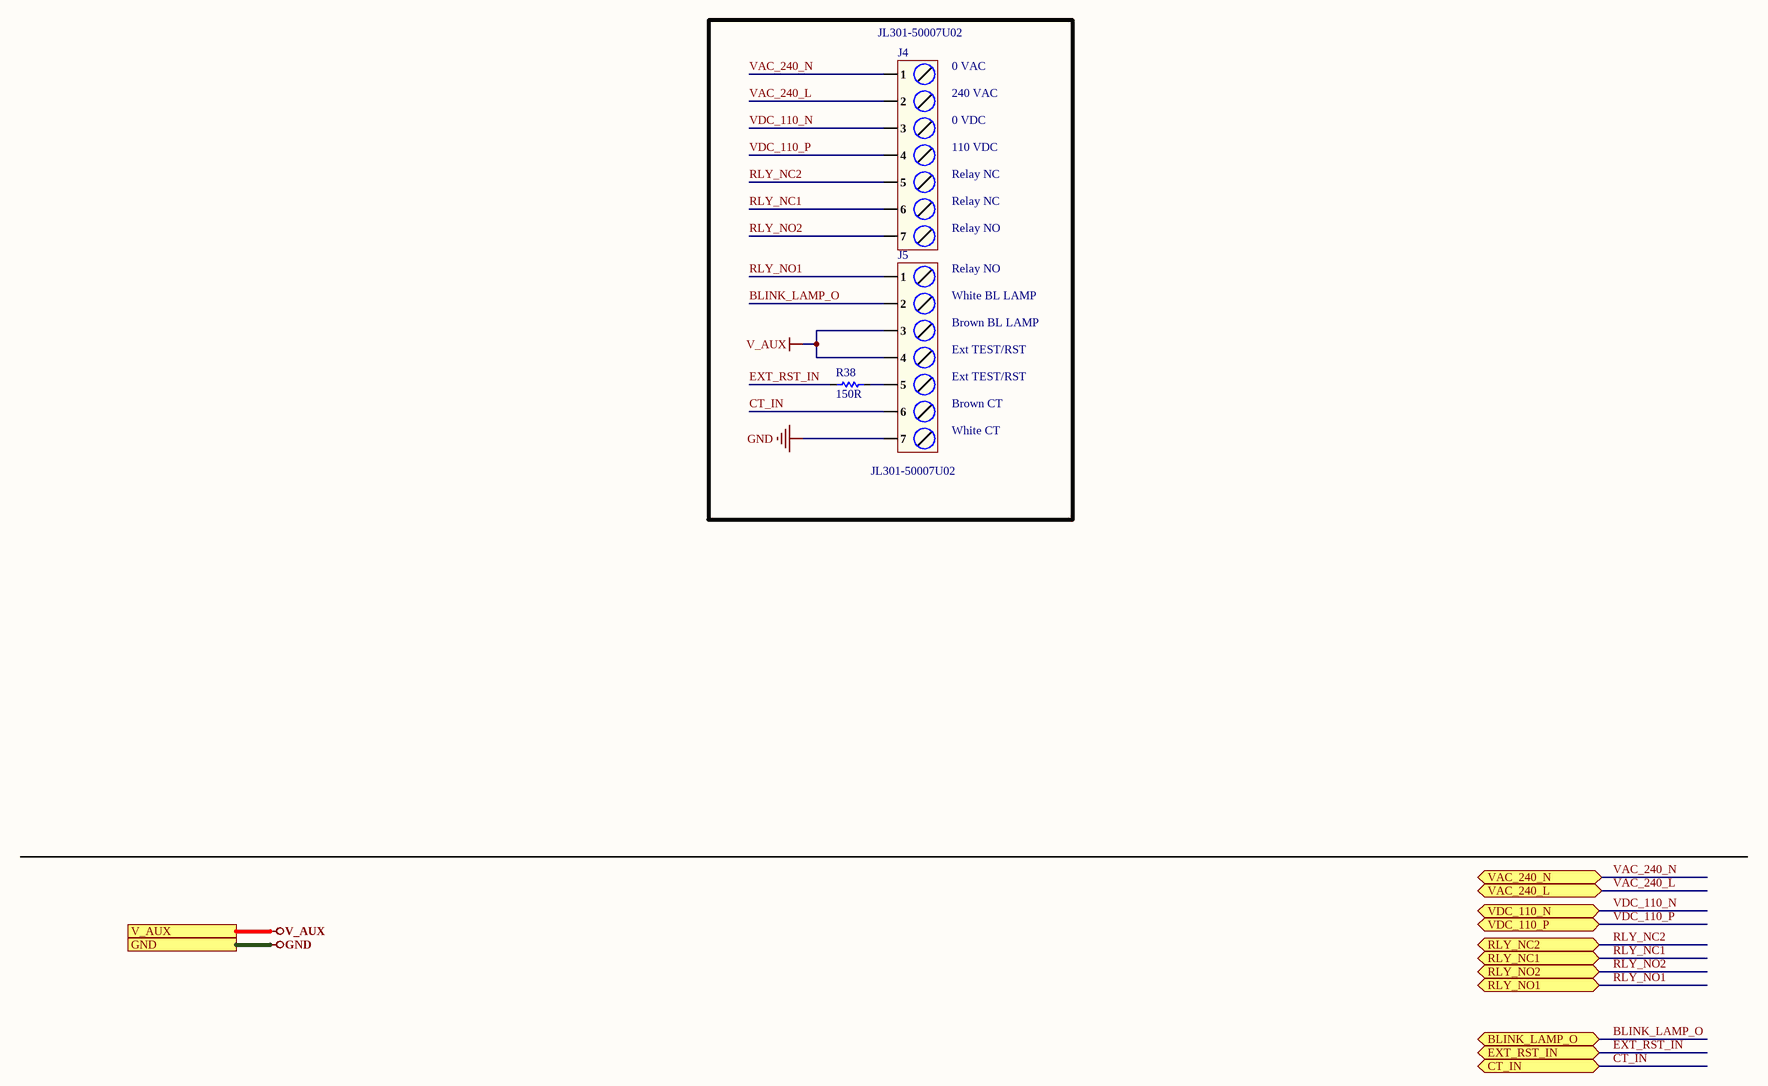
[diagram p3: Connector_Sheet.SchDoc]

### Parts
J4  JL301-50007U02  [JL301-50007U02]
J5  JL301-50007U02  [JL301-50007U02]
R38  150R  [Res-1206]

### Ports
BLINK_LAMP_O (bidir, see Top-Sheet[5B], Peripheral_Sheet[4D]), CT_IN (bidir, see Top-Sheet[5B], Peripheral_Sheet[4D]), EXT_RST_IN (bidir, see Top-Sheet[5B], Peripheral_Sheet[4D]), GND (see Top-Sheet[5A], Controller_Sheet[1D], Peripheral_Sheet[1D], Power_Sheet[1D]), RLY_NC1 (bidir, see Top-Sheet[5B], Peripheral_Sheet[4D]), RLY_NC2 (bidir, see Top-Sheet[5B], Peripheral_Sheet[4D]), RLY_NO1 (bidir, see Top-Sheet[5B], Peripheral_Sheet[4D]), RLY_NO2 (bidir, see Top-Sheet[5B], Peripheral_Sheet[4D]), V_AUX (see Top-Sheet[5A], Peripheral_Sheet[1D], Power_Sheet[1D]), VAC_240_L (bidir, see Top-Sheet[5B], Peripheral_Sheet[4D]), VAC_240_N (bidir, see Top-Sheet[5B], Peripheral_Sheet[4D]), VDC_110_N (bidir, see Top-Sheet[5B], Peripheral_Sheet[4D]), VDC_110_P (bidir, see Top-Sheet[5B], Peripheral_Sheet[4D])

### Nets
GND: J5.7 ; port GND
V_AUX: J5.3 J5.4 ; port V_AUX
BLINK_LAMP_O: J5.2 ; port BLINK_LAMP_O
CT_IN: J5.6 ; port CT_IN
EXT_RST_IN: R38.1 ; port EXT_RST_IN
RLY_NC1: J4.6 ; port RLY_NC1
RLY_NC2: J4.5 ; port RLY_NC2
RLY_NO1: J5.1 ; port RLY_NO1
RLY_NO2: J4.7 ; port RLY_NO2
VAC_240_L: J4.2 ; port VAC_240_L
VAC_240_N: J4.1 ; port VAC_240_N
VDC_110_N: J4.3 ; port VDC_110_N
VDC_110_P: J4.4 ; port VDC_110_P
NetJ5_5: J5.5 R38.2

### Notes on the sheet
- 0 VAC
- 0 VDC
- 240 VAC
- Relay NC
- 110 VDC
- Relay NO
- Brown BL LAMP
- White BL LAMP
- Brown CT
- Ext TEST/RST
- White CT
- Reflect Ein Technology Labs Sdn Bhd
- File:
- Title:
- Date:
- Page
- Num:
- Total:
- Drawn By: Nabil bin Feisal Bamadhaj

### Library data of the parts
J4 J5 = JL301-50007U02: 1x7P -40℃~+105℃ 15A 300V Blue 12~24 Direct Insert 5mm 1 7 Plugin,P=5mm Screw Terminal Blocks ROHS; Manufacturer: JILN; Manufacturer Part Number: JL301-50007U02; Package: Plugin,P=5mm; LCSC Part Number: C409139; Item Type: Screw Terminal; ComponentLink1Description: LCSC; ComponentLink1URL: https://www.lcsc.com/product-detail/Screw-Terminal-Blocks_JILN-JL301-50007U02_C409139.html
R38 = FRC1206F1500TS: as R13 on sheet Controller_Sheet; Manufacturer Part Number: FRC1206F1500TS; Package: 1206; LCSC Part Number: C2933598; Item Type: Resistor; ComponentLink1Description: LCSC; ComponentLink1URL: https://www.lcsc.com/product-detail/Chip-Resistor-Surface-Mount_FOJAN-FRC1206F1500TS_C2933598.html

## Sheet Peripheral_Sheet.SchDoc
size 420 x 297 mm; SheetNumber: 4; SheetTotal: 5
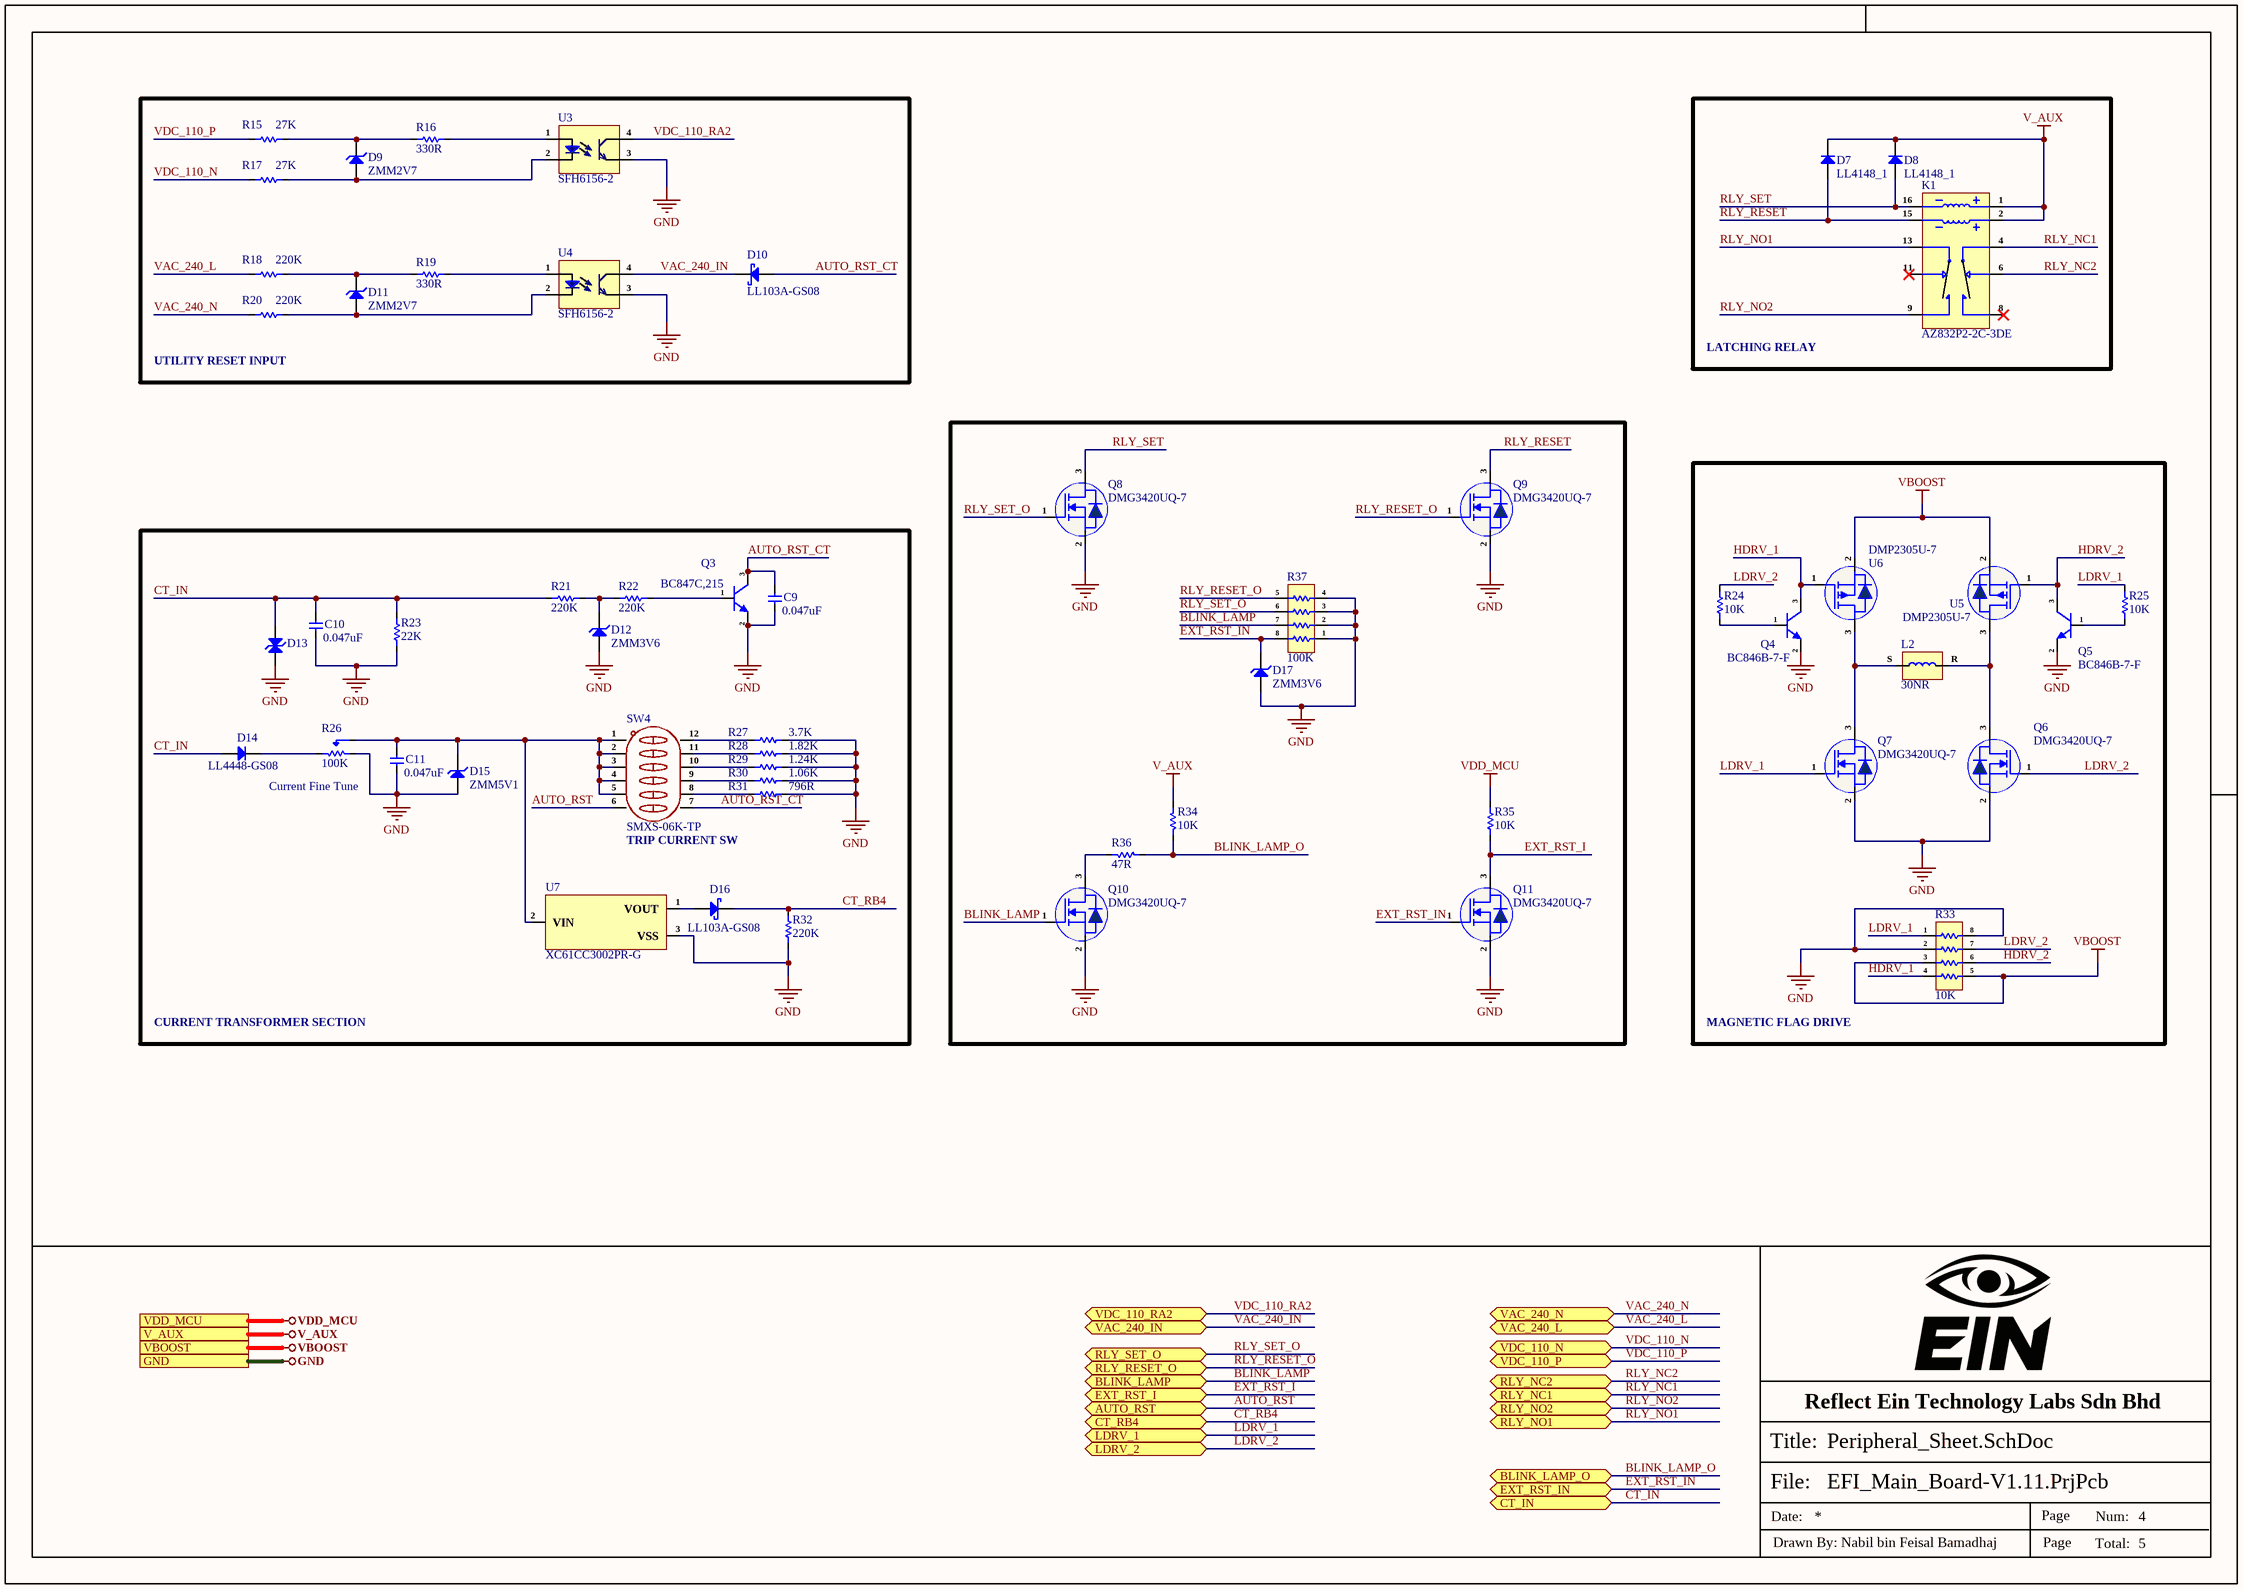
[diagram p4: Peripheral_Sheet.SchDoc]

### Parts
C9  0.047uF  [Cap-1206]
C10  0.047uF  [Cap-1206]
C11  0.047uF  [Cap-1206]
D7  LL4148_1  [LL-34]
D8  LL4148_1  [LL-34]
D9  ZMM2V7  [LL-34]
D10  LL103A-GS08  [LL-34]
D11  ZMM2V7  [LL-34]
D12  ZMM3V6  [LL-34]
D13  SMAJ130CA-E3/61  [SMA Bi Directional]  (value not drawn)
D14  LL4448-GS08  [LL-34]
D15  ZMM5V1  [LL-34]
D16  LL103A-GS08  [LL-34]
D17  ZMM3V6  [LL-34]
K1  AZ832P2-2C-3DE  [AZ832P2-2C-3DE]
L2  30NR  [30NR]
Q3  BC847C,215  [SOT-23]
Q4  BC846B-7-F  [SOT-23]
Q5  BC846B-7-F  [SOT-23]
Q6  DMG3420UQ-7  [SOT-23]
Q7  DMG3420UQ-7  [SOT-23]
Q8  DMG3420UQ-7  [SOT-23]
Q9  DMG3420UQ-7  [SOT-23]
Q10  DMG3420UQ-7  [SOT-23]
Q11  DMG3420UQ-7  [SOT-23]
R15  27K  [Res-1206]
R16  330R  [Res-1206]
R17  27K  [Res-1206]
R18  220K  [Res-1206]
R19  330R  [Res-1206]
R20  220K  [Res-1206]
R21  220K  [Res-1206]
R22  220K  [Res-1206]
R23  22K  [Res-1206]
R24  10K  [Res-1206]
R25  10K  [Res-1206]
R26  100K  [T93YA104KT20]
R27  3.7K  [Res-1206]
R28  1.82K  [Res-1206]
R29  1.24K  [Res-1206]
R30  1.06K  [Res-1206]
R31  796R  [Res-1206]
R32  220K  [Res-1206]
R33  10K  [0603x4]
R34  10K  [Res-1206]
R35  10K  [Res-1206]
R36  47R  [Res-1206]
R37  100K  [YC164-JR-070RL]
SW4  SMXS-06K-TP  [SMXS-06K-TP]
U3  SFH6156-2  [SFH6156-2]
U4  SFH6156-2  [SFH6156-2]
U5  DMP2305U-7  [SOT-23]
U6  DMP2305U-7  [SOT-23]
U7  XC61CC3002PR-G  [SOT-89-3]

### Blocks framed on the sheet
UTILITY RESET INPUT: D9-D11 R15-R20 U3 U4
LATCHING RELAY: D7 D8 K1
MAGNETIC FLAG DRIVE: L2 Q4-Q7 R24 R25 R33 U5 U6

### Ports
AUTO_RST (bidir, see Top-Sheet[4B], Controller_Sheet[4D]), BLINK_LAMP (bidir, see Top-Sheet[4B], Controller_Sheet[4D]), BLINK_LAMP_O (bidir, see Top-Sheet[4B], Connector_Sheet[4D]), CT_IN (bidir, see Top-Sheet[4B], Connector_Sheet[4D]), CT_RB4 (bidir, see Top-Sheet[4B], Controller_Sheet[4D]), EXT_RST_I (bidir, see Top-Sheet[4B], Controller_Sheet[4D]), EXT_RST_IN (bidir, see Top-Sheet[4B], Connector_Sheet[4D]), GND (see Top-Sheet[4B], Connector_Sheet[1D], Controller_Sheet[1D], Power_Sheet[1D]), LDRV_1 (bidir, see Top-Sheet[4B], Controller_Sheet[4D]), LDRV_2 (bidir, see Top-Sheet[4B], Controller_Sheet[4D]), RLY_NC1 (bidir, see Top-Sheet[4B], Connector_Sheet[4D]), RLY_NC2 (bidir, see Top-Sheet[4B], Connector_Sheet[4D]), RLY_NO1 (bidir, see Top-Sheet[4B], Connector_Sheet[4D]), RLY_NO2 (bidir, see Top-Sheet[4B], Connector_Sheet[4D]), RLY_RESET_O (bidir, see Top-Sheet[4B], Controller_Sheet[4D]), RLY_SET_O (bidir, see Top-Sheet[4B], Controller_Sheet[4D]), V_AUX (see Top-Sheet[4A], Connector_Sheet[1D], Power_Sheet[1D]), VAC_240_IN (bidir, see Top-Sheet[4B], Controller_Sheet[4D]), VAC_240_L (bidir, see Top-Sheet[4B], Connector_Sheet[4D]), VAC_240_N (bidir, see Top-Sheet[4B], Connector_Sheet[4D]), VBOOST (see Top-Sheet[4B], Power_Sheet[1D]), VDC_110_N (bidir, see Top-Sheet[4B], Connector_Sheet[4D]), VDC_110_P (bidir, see Top-Sheet[4B], Connector_Sheet[4D]), VDC_110_RA2 (bidir, see Top-Sheet[4B], Controller_Sheet[4D]), VDD_MCU (see Top-Sheet[4A], Controller_Sheet[1D], Power_Sheet[1D])